# EasyEDA Pro project RK3566_handy_V1.0.epro, schematic RK3566_2, sheets 1 to 8 of 25

## Sheets
1 RK3566_POWER: Board Name: RK3566主板_V2; Create Date: 2026-09-04; Page Name: RK3566_POWER; Project Name: RK3566掌上机; Schematic Name: RK3566_1; Update Date: 2026-09-04; Company: 嘉立创EDA; Page Size: A4; Version: V1.0
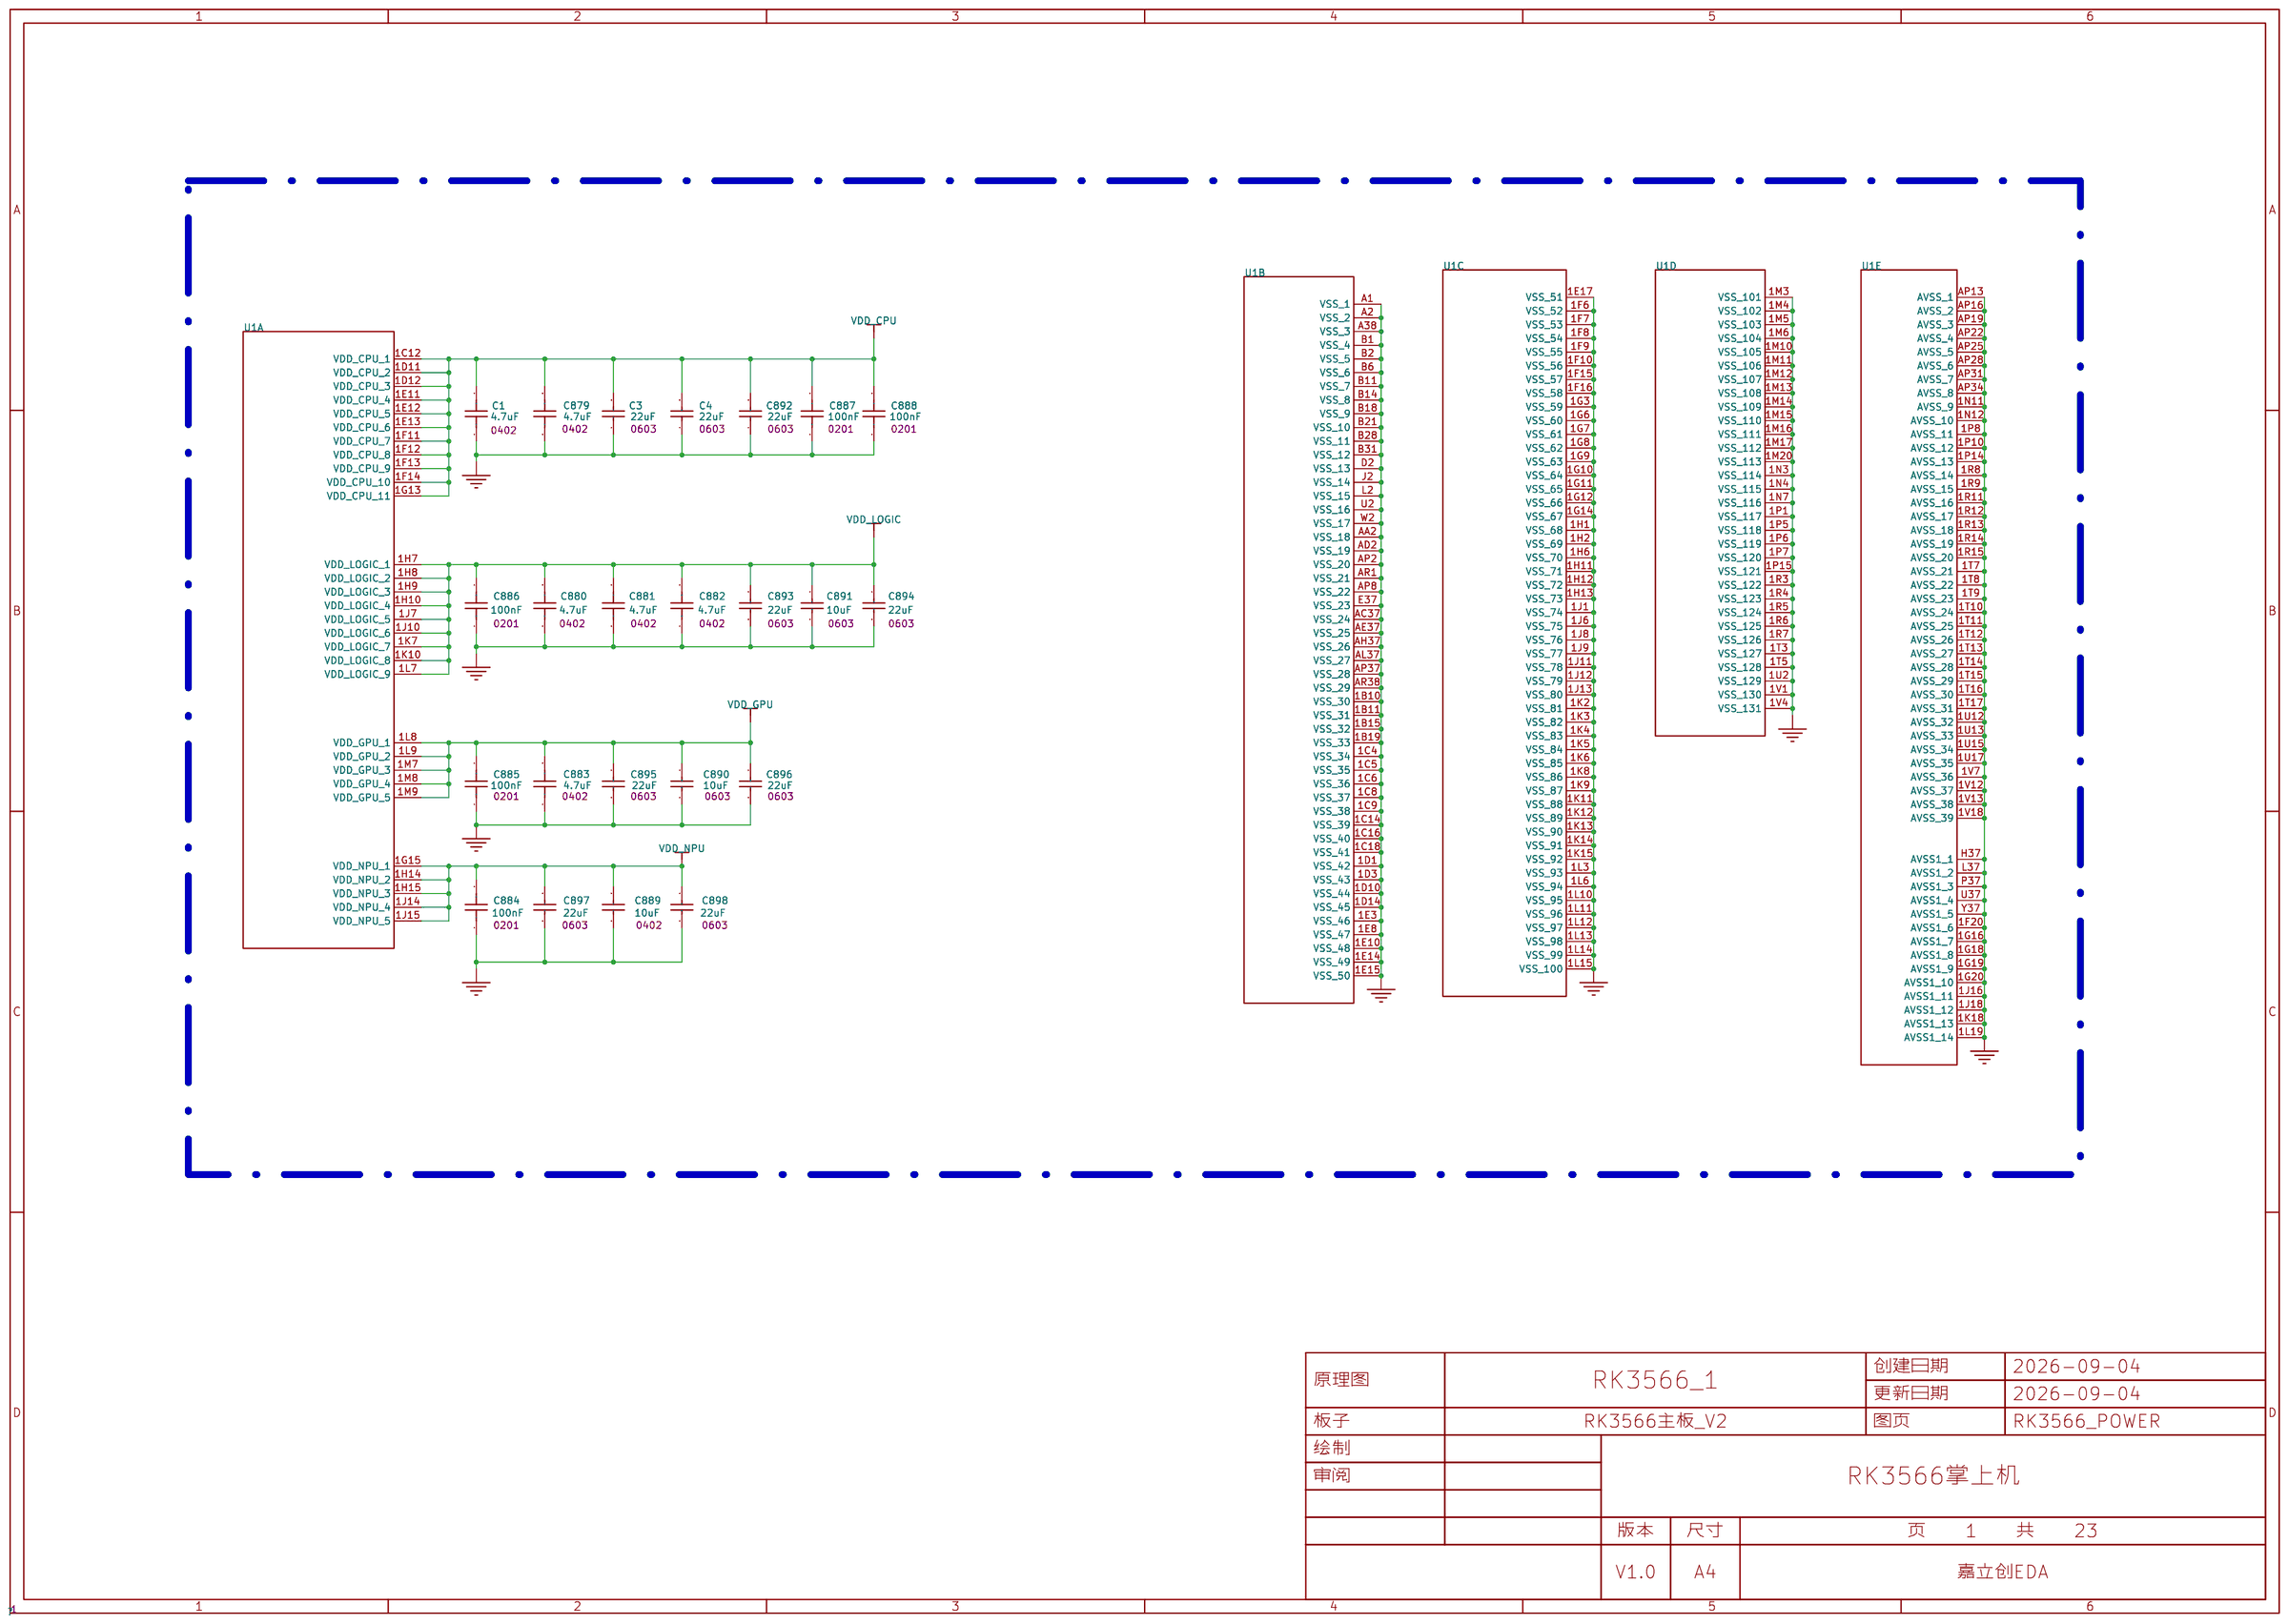
[diagram p0: RK3566_POWER]
2 RK3566_DDR PHY: Page Name: RK3566_DDR PHY
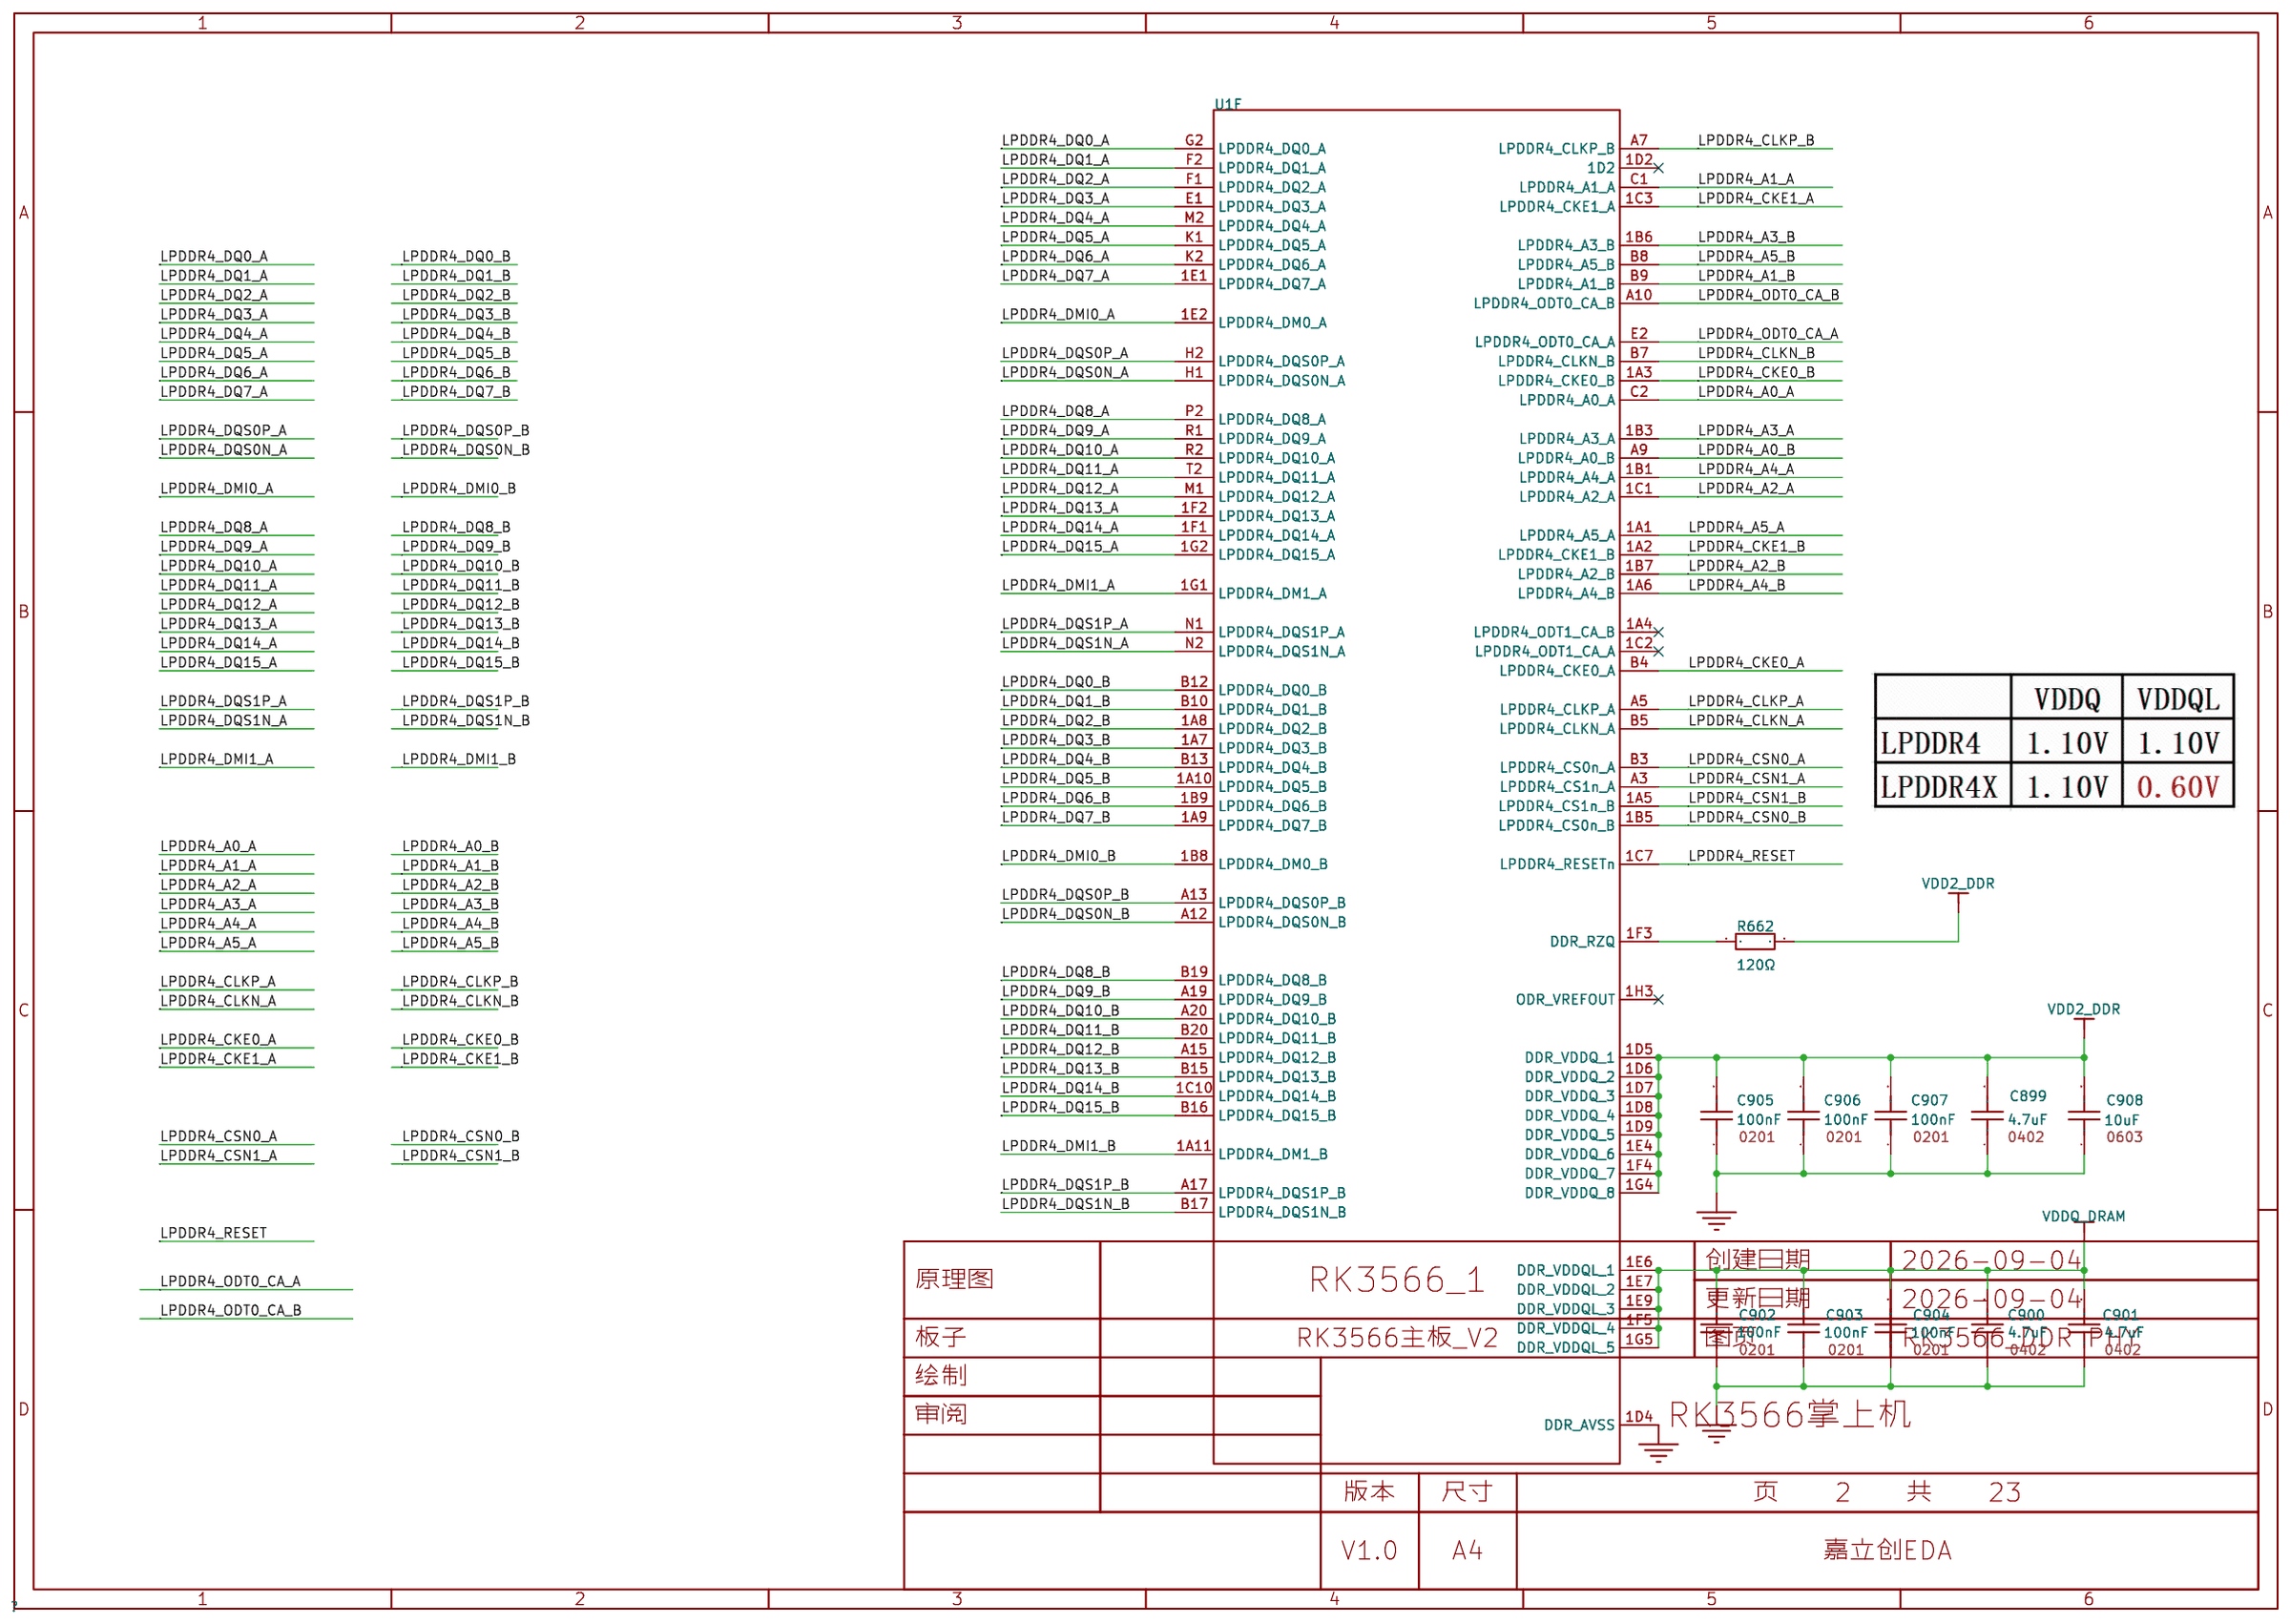
[diagram p1: RK3566_DDR PHY]
3 RK3566_EMMC/SD: Page Name: RK3566_EMMC/SD
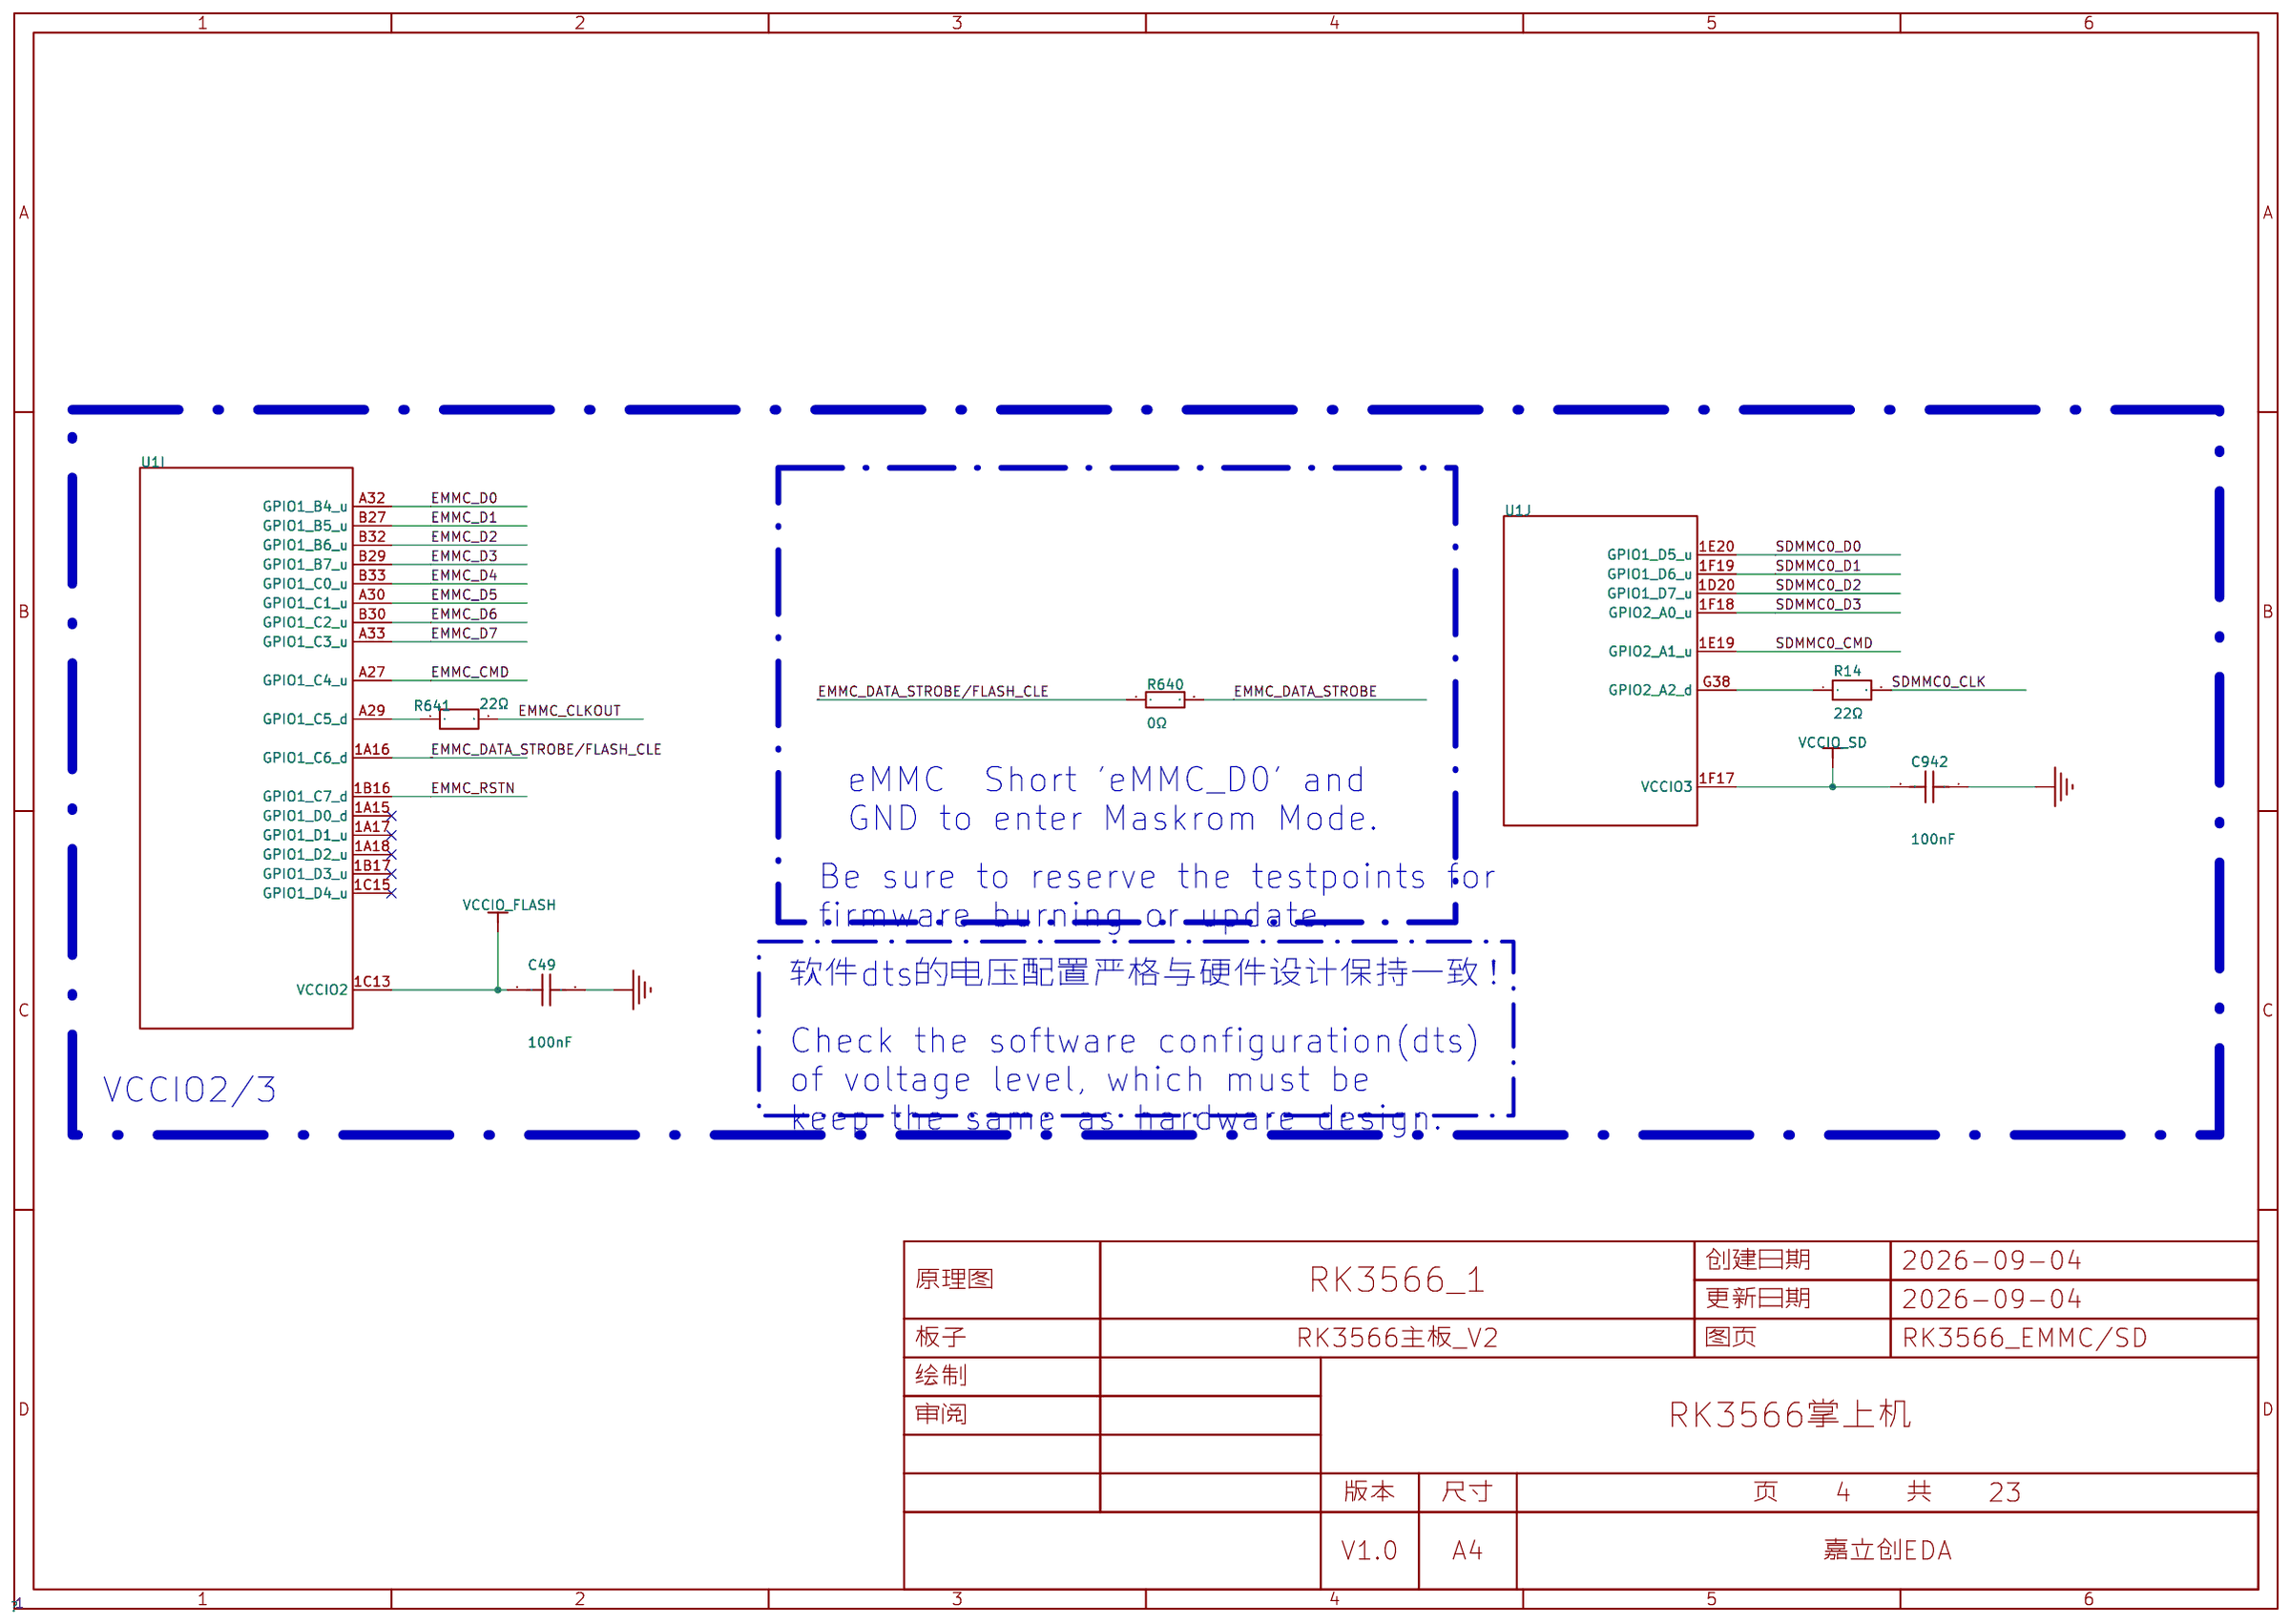
[diagram p2: RK3566_EMMC/SD]
4 RK3566_VO INTERFACE_1: Page Name: RK3566_VO INTERFACE_1
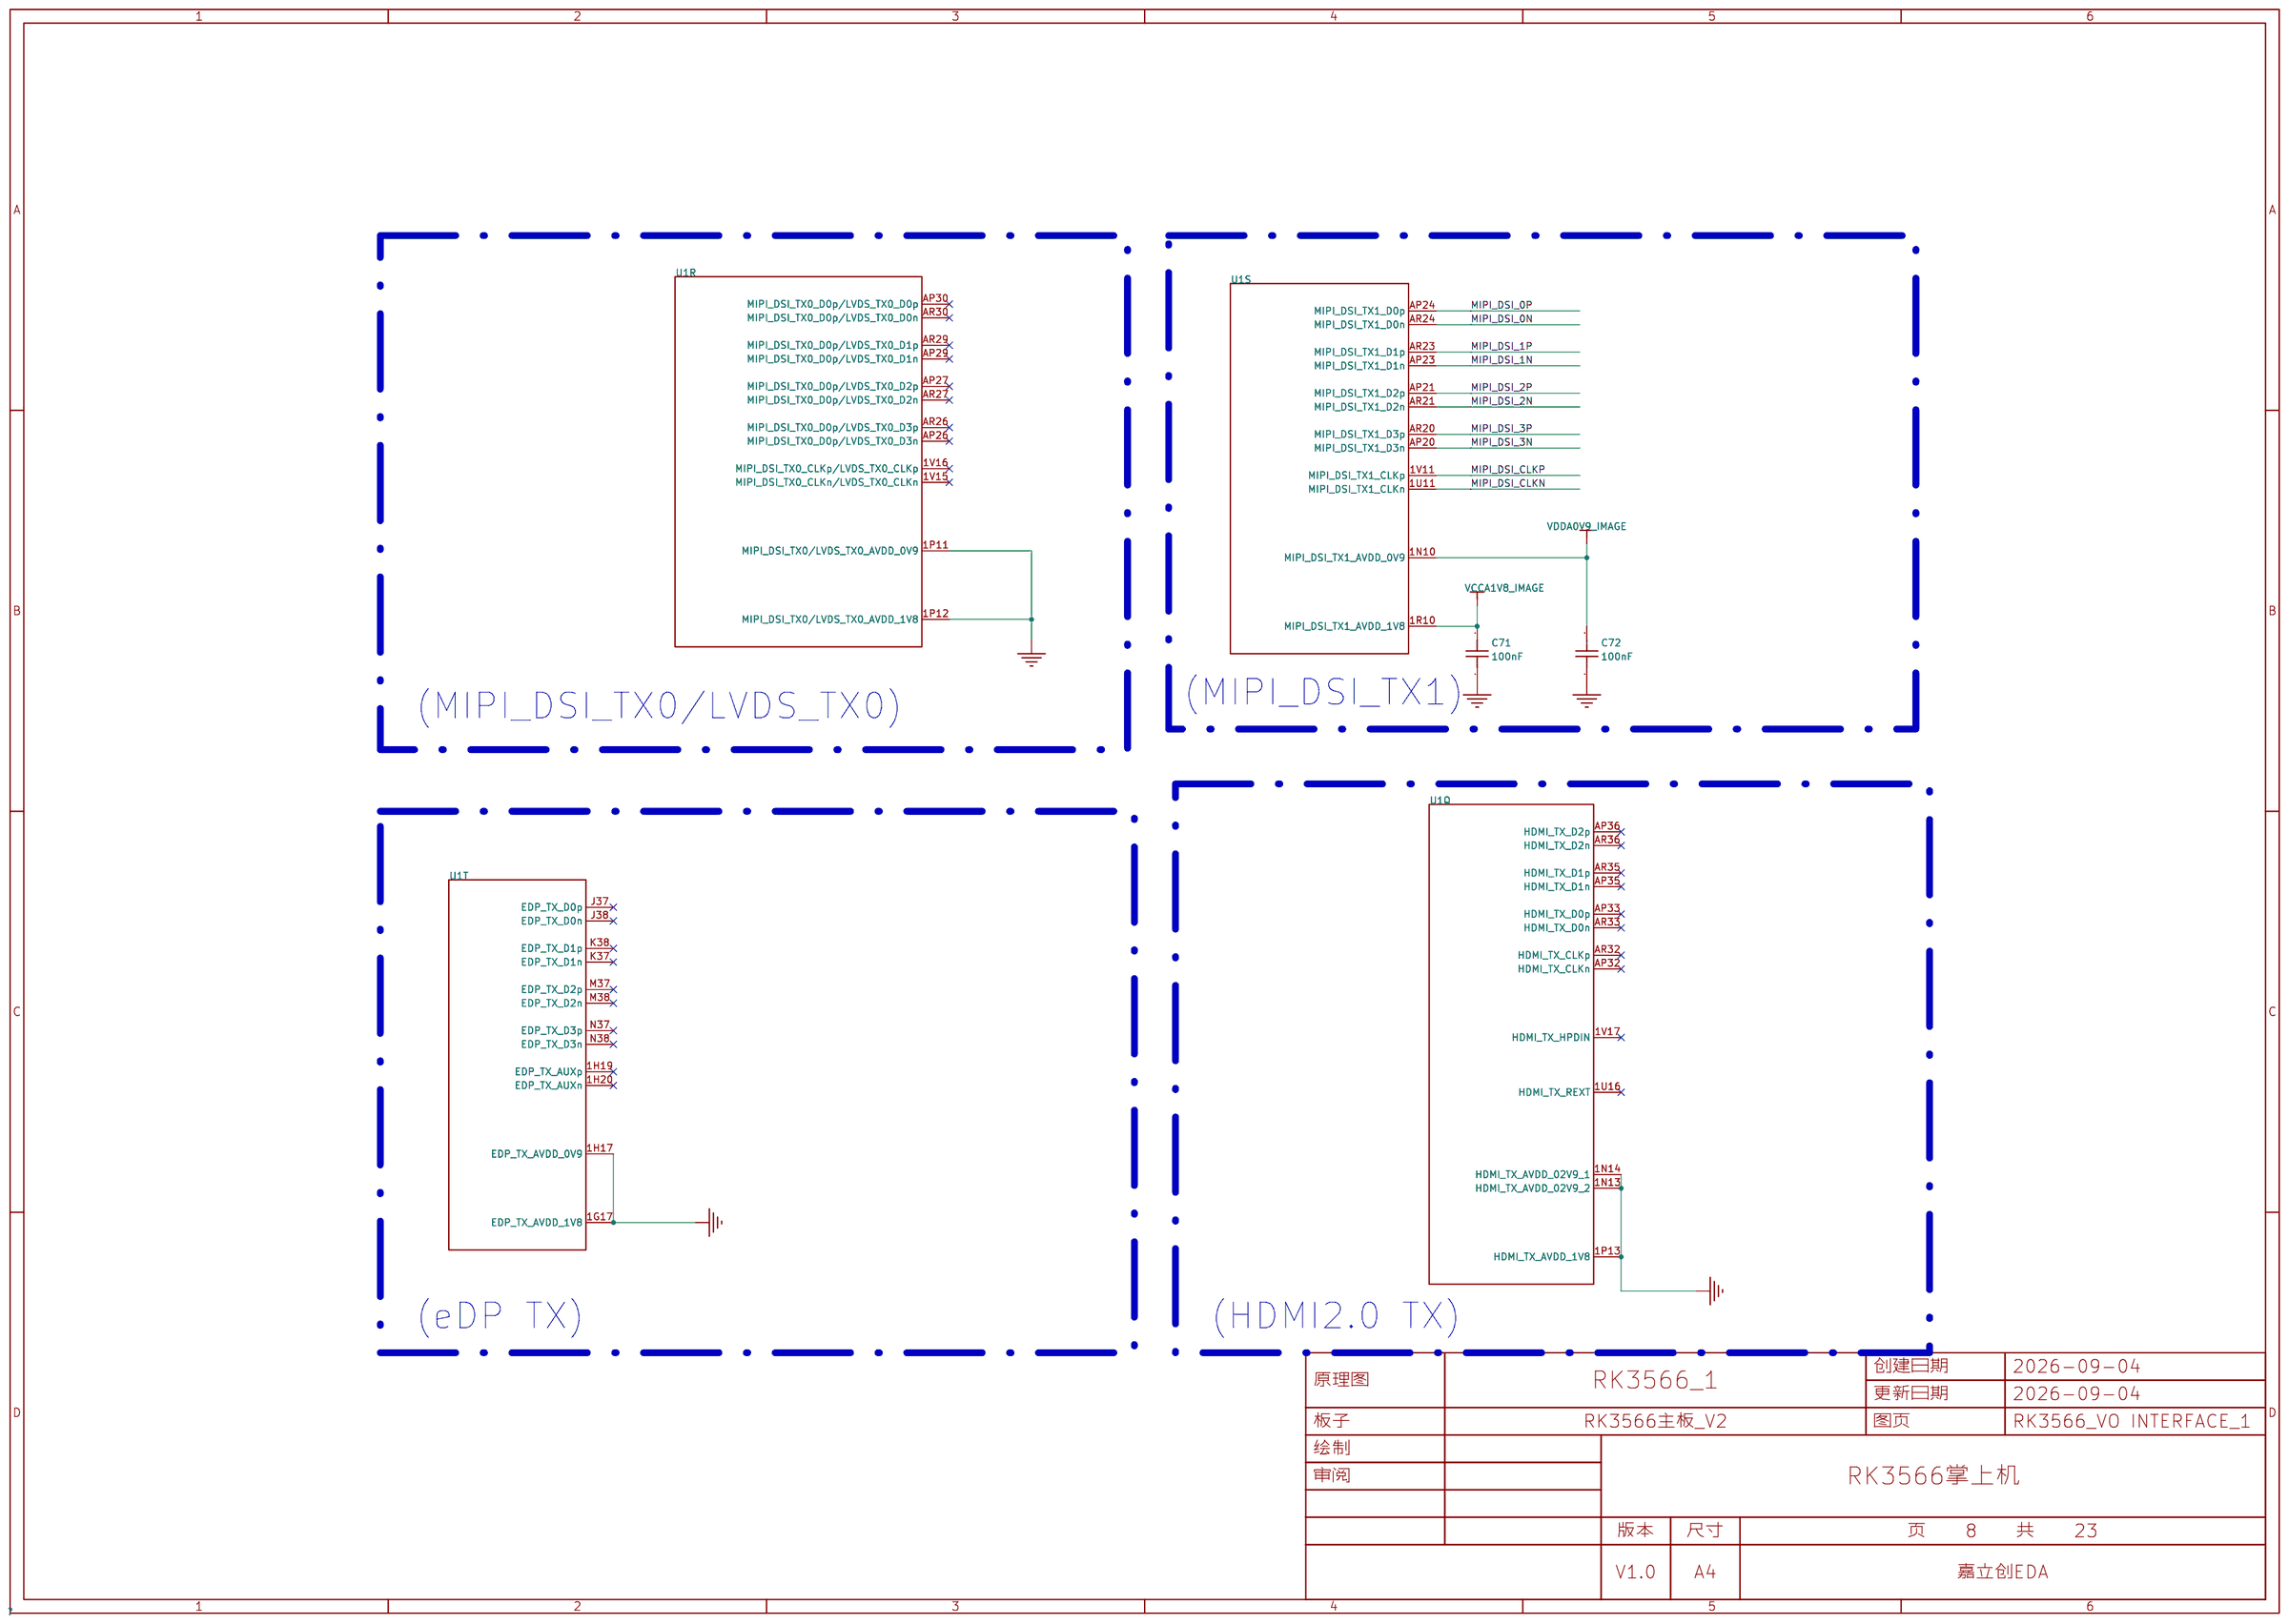
[diagram p3: RK3566_VO INTERFACE_1]
5 RK3566_AUDIO INTERFACE: Board Name: RK3566主板; Page Name: RK3566_AUDIO INTERFACE; Schematic Name: RK3566
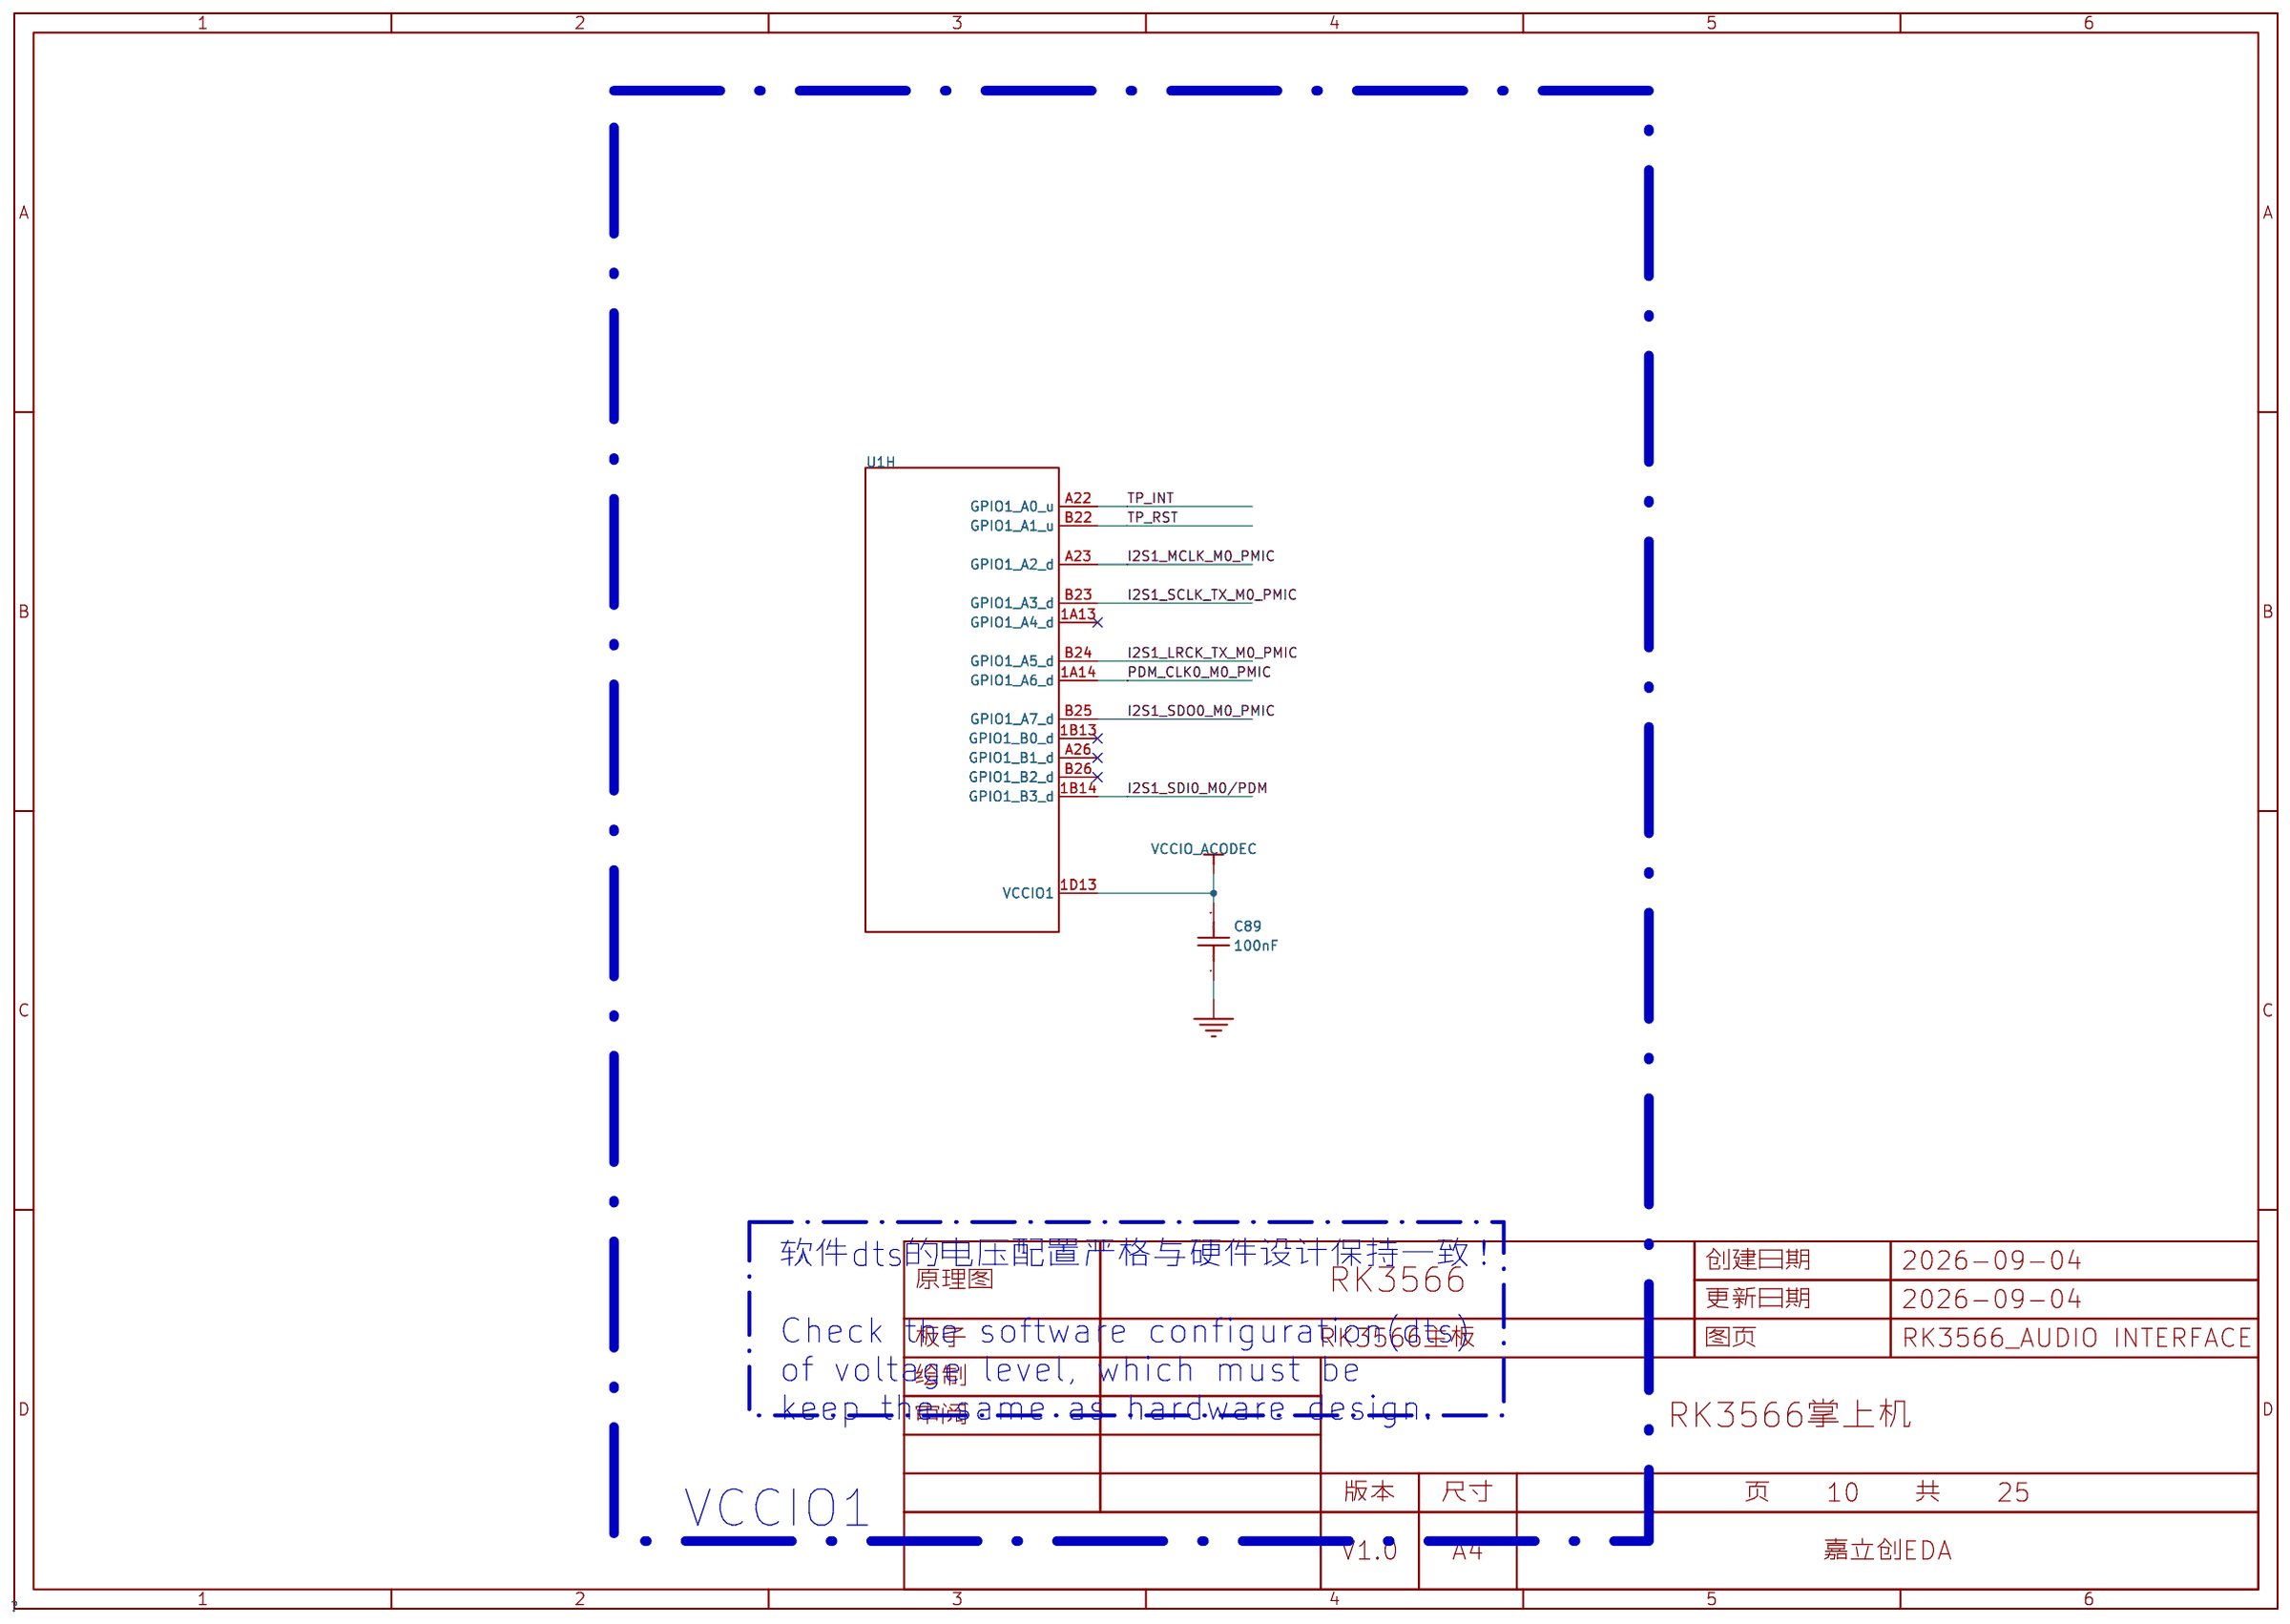
[diagram p4: RK3566_AUDIO INTERFACE]
6 USB OTG: Create Date: 2026-09-19; Page Name: USB OTG; Update Date: 2026-09-19
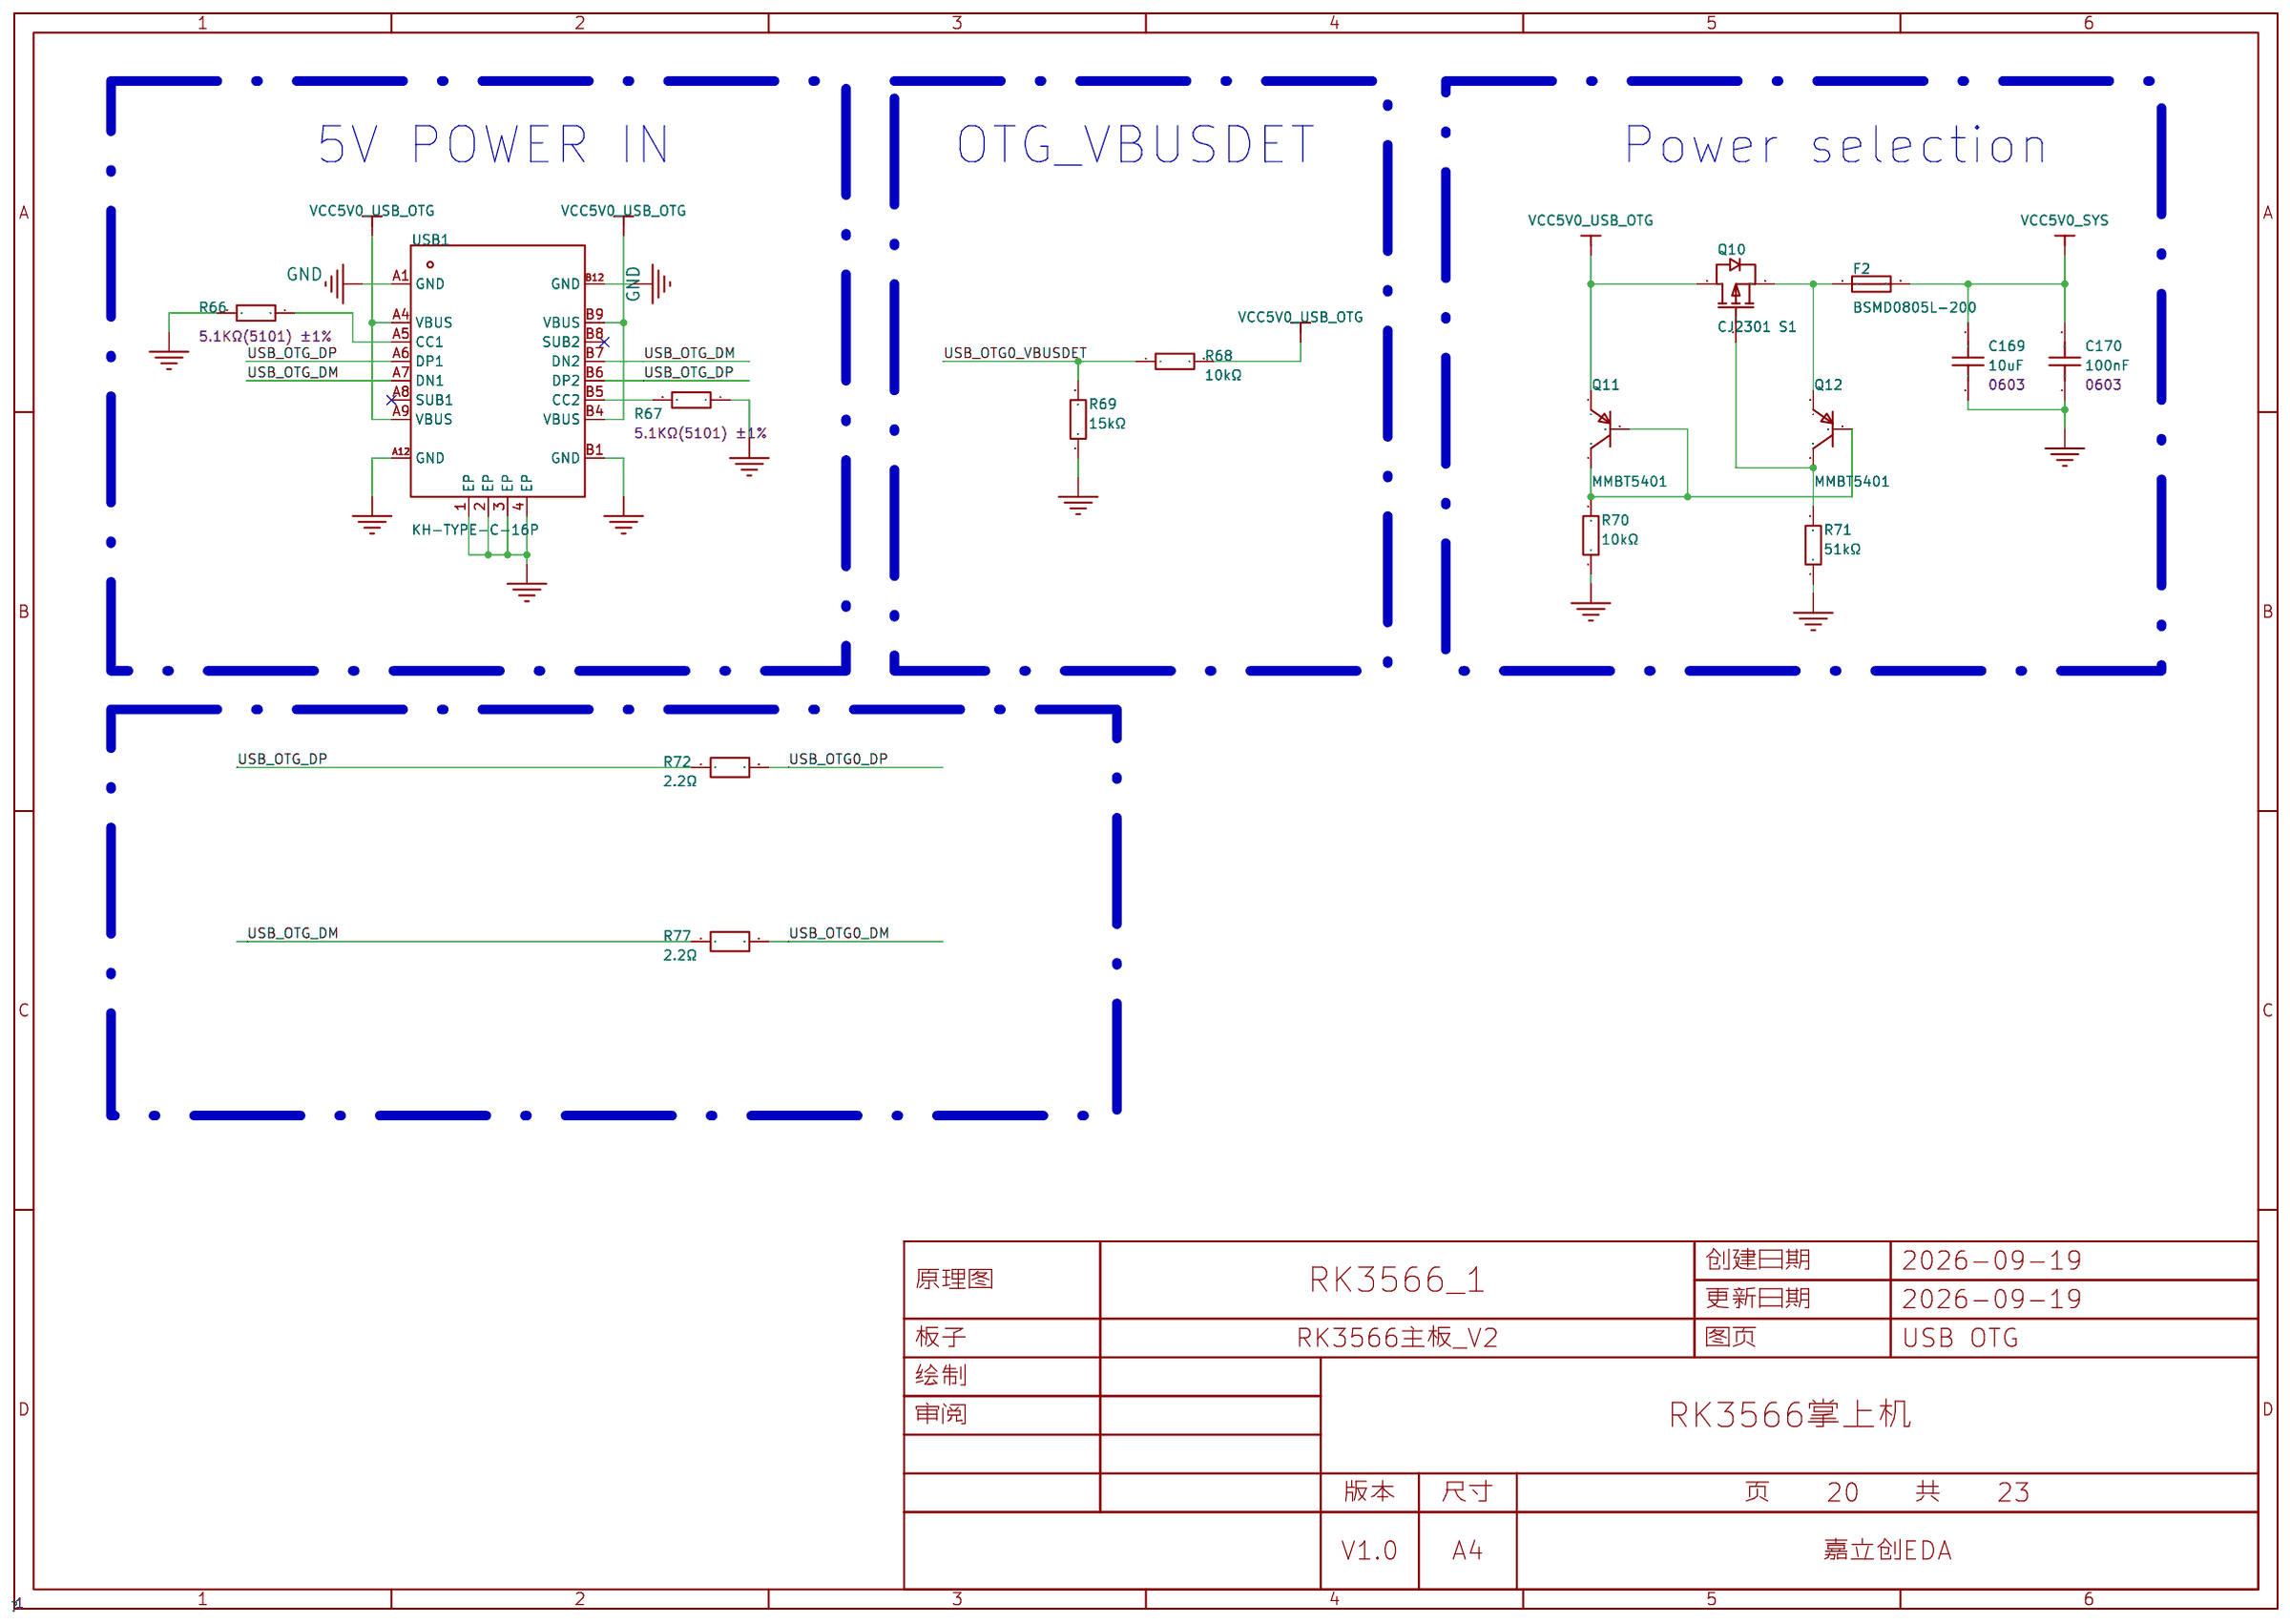
[diagram p5: USB OTG]
7 MIPI_DSI: Create Date: 2026-09-19; Page Name: MIPI_DSI; Update Date: 2026-09-19
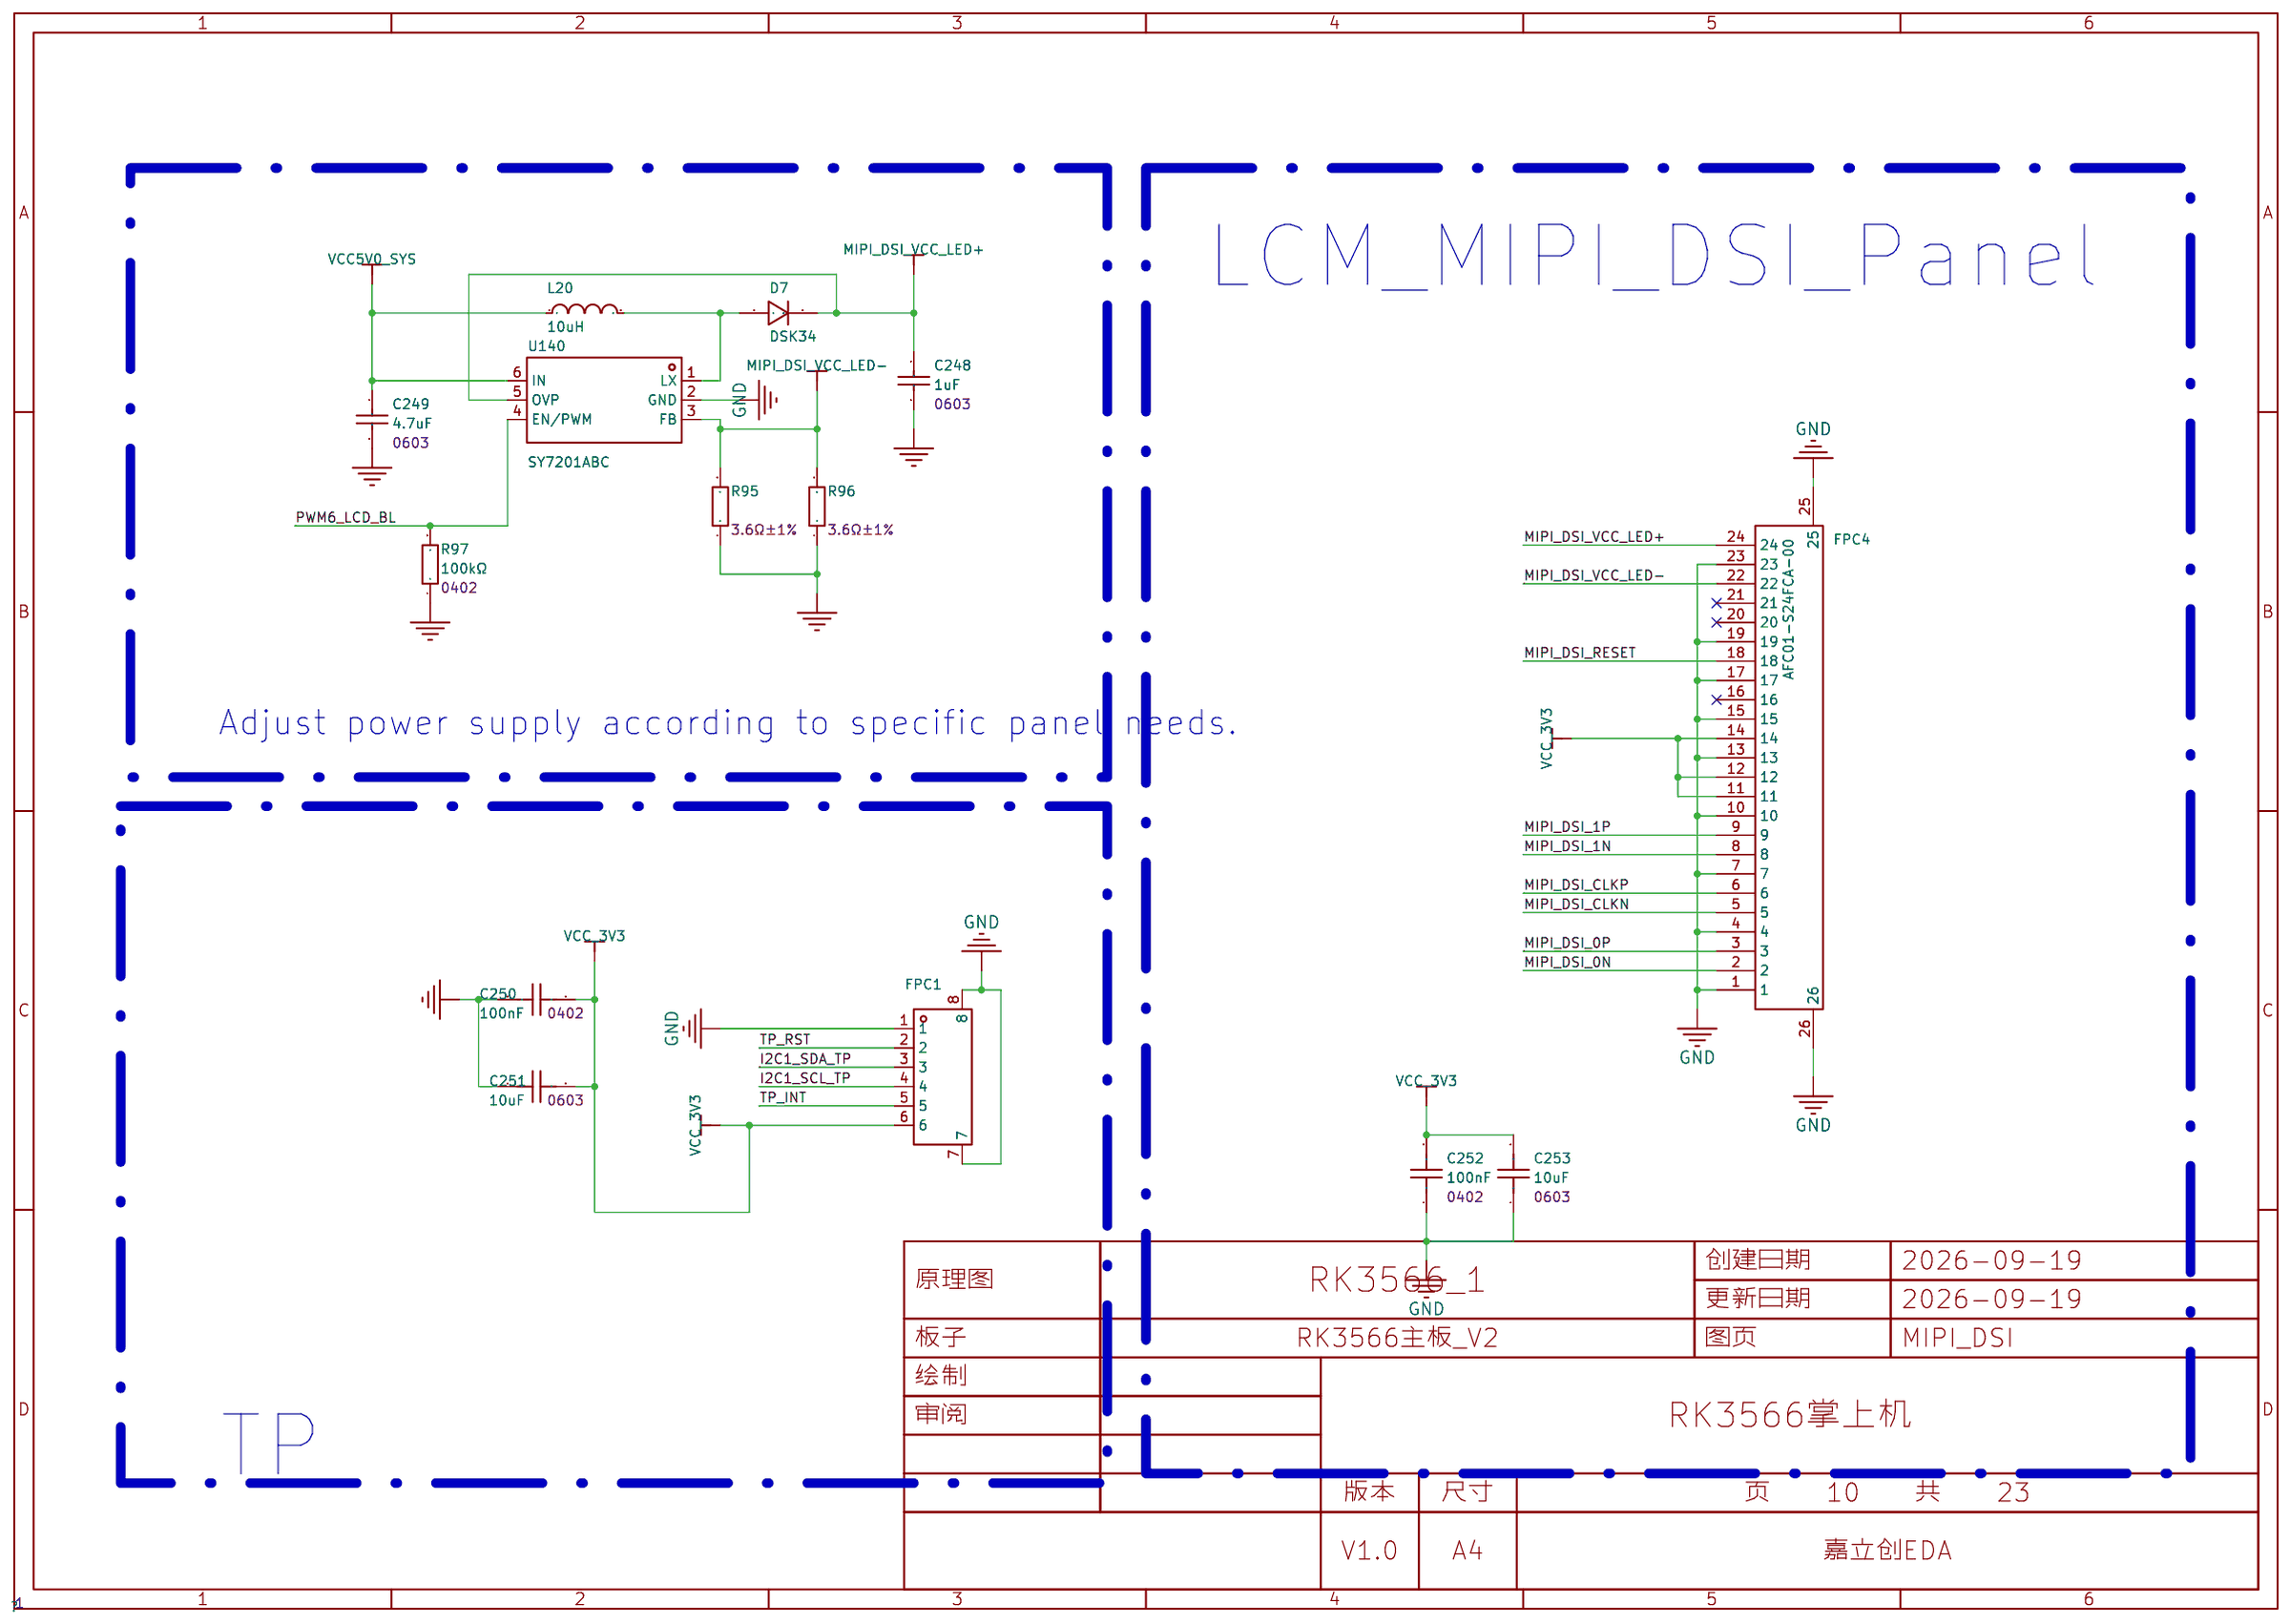
[diagram p6: MIPI_DSI]
8 RK3566_USB/PCIE PHY: Create Date: 2026-09-19; Page Name: RK3566_USB/PCIE PHY; Update Date: 2026-09-19
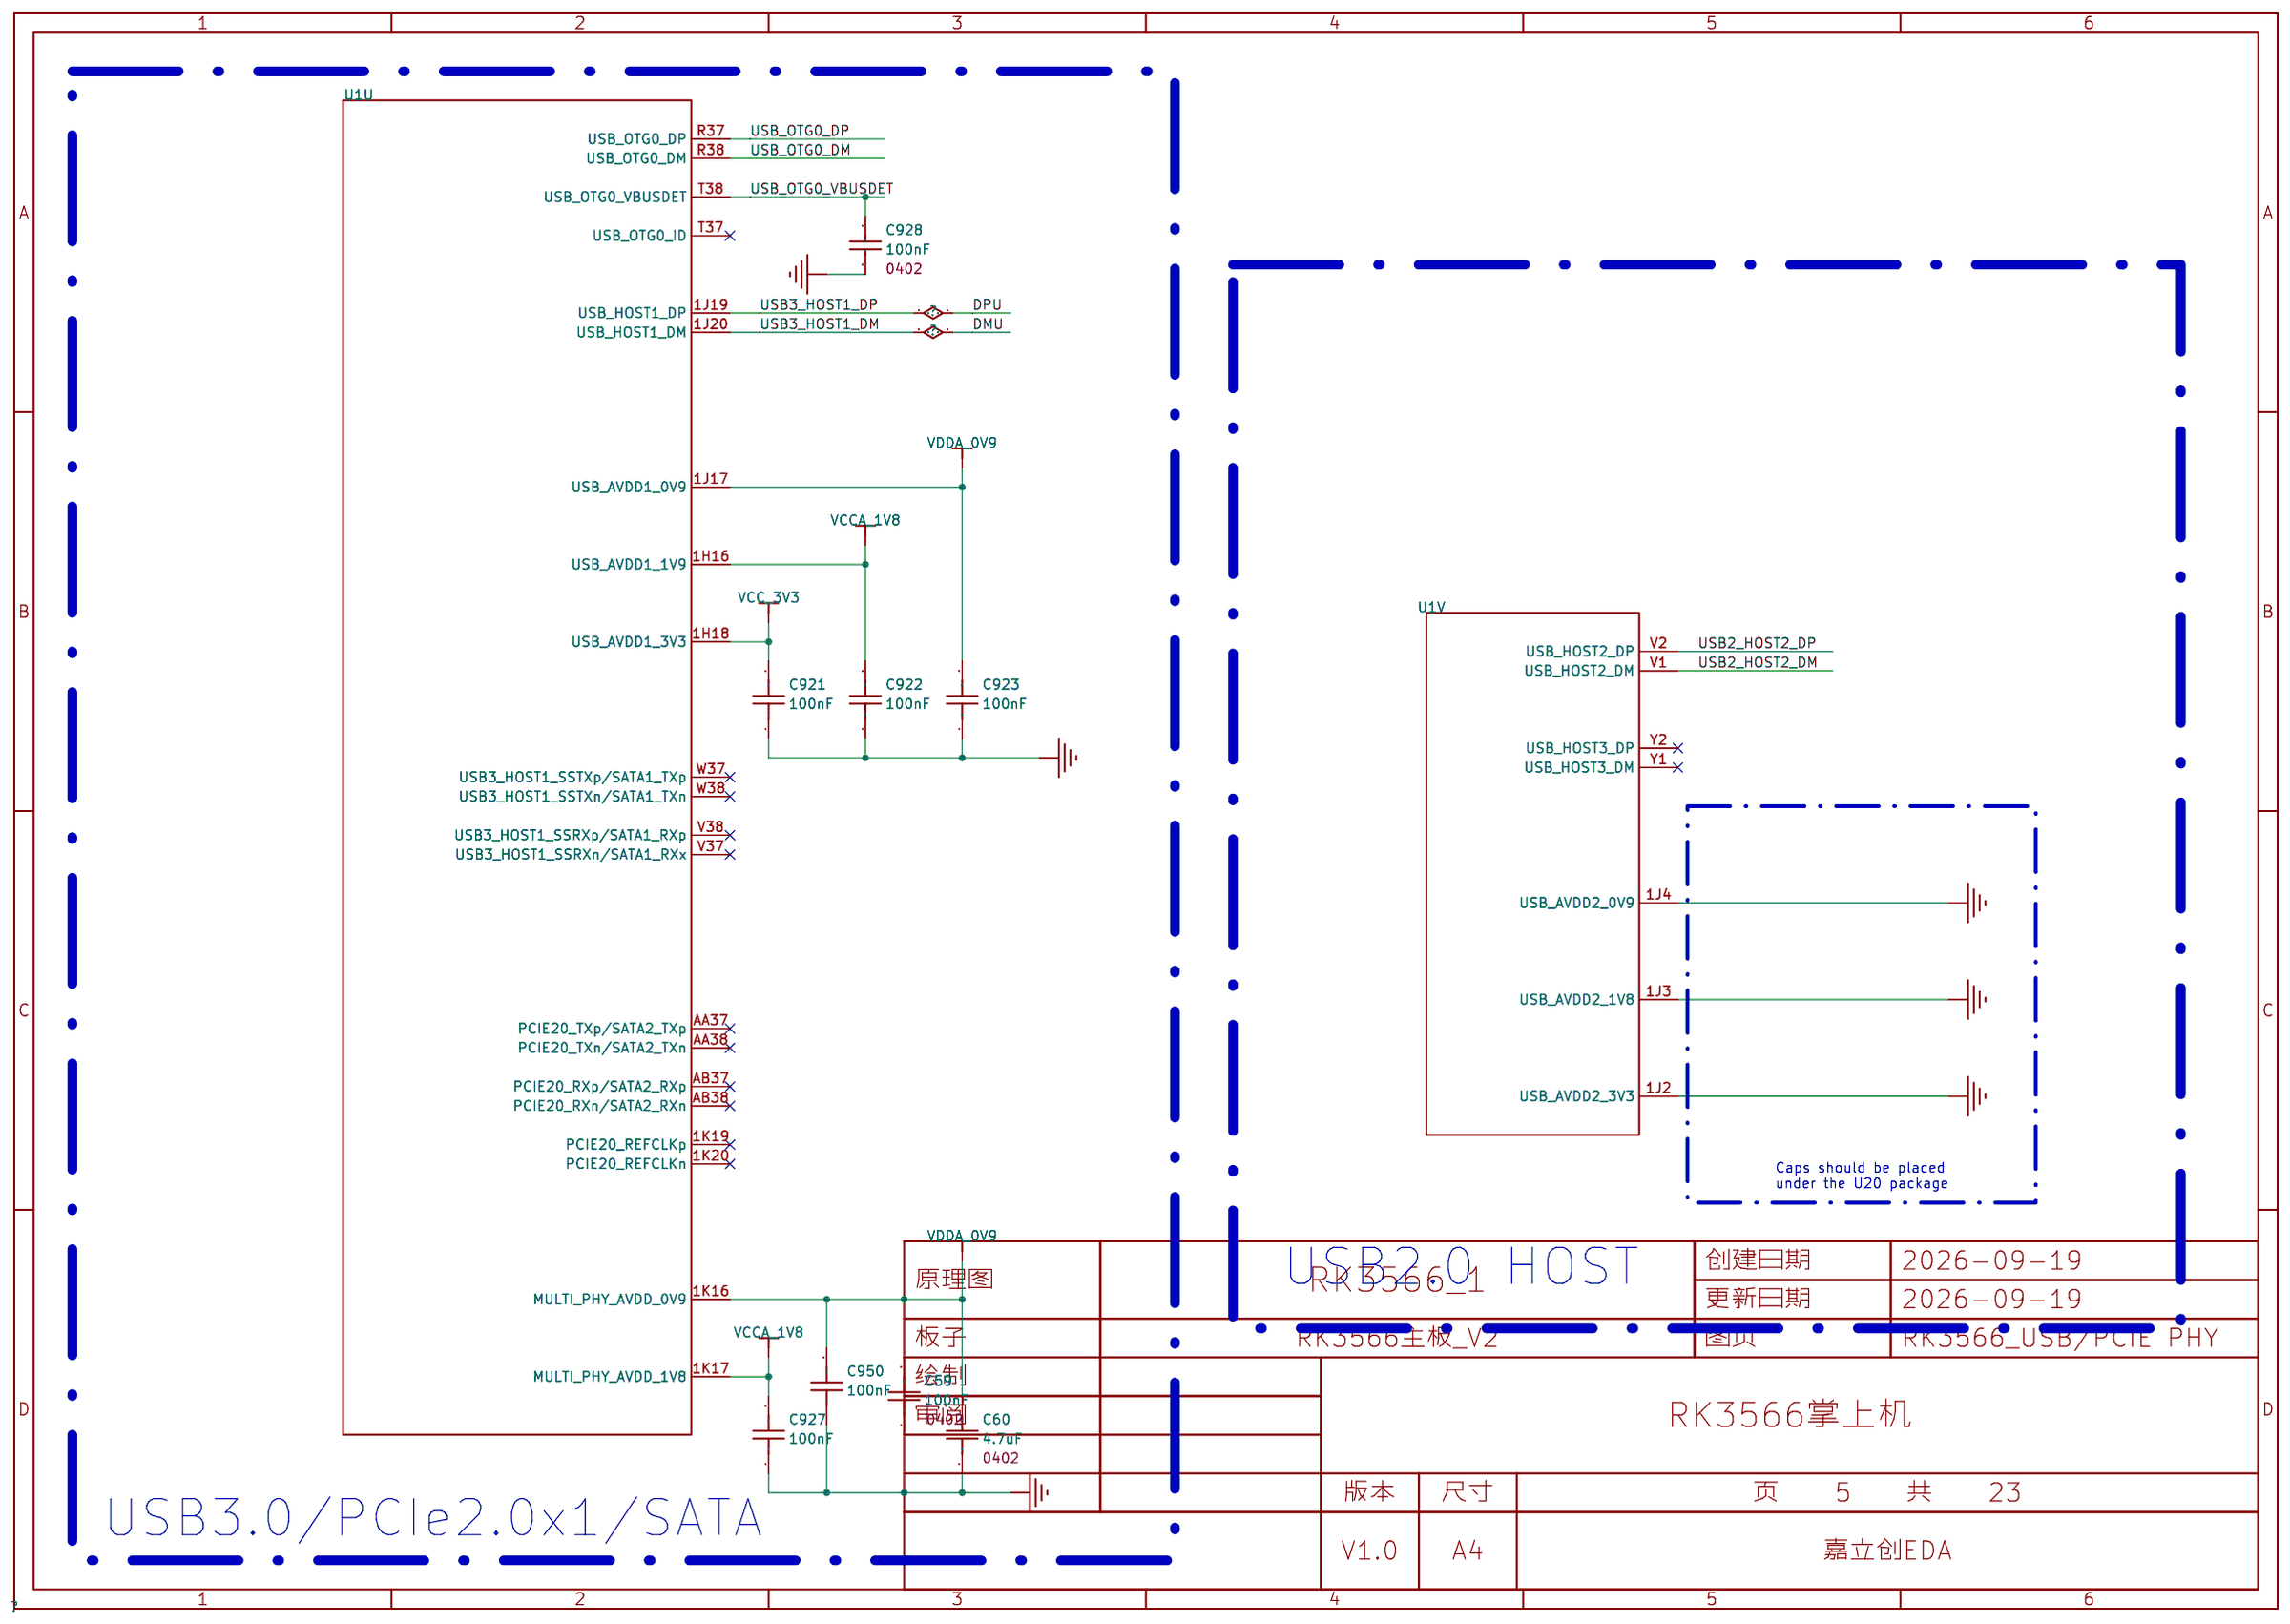
[diagram p7: RK3566_USB/PCIE PHY]

## Parts
sheet MIPI_DSI
C248  1uF  [LL_0603]
C249  4.7uF  [LL_0603]
C250  100nF  [LL_0402]
C251  10uF  [LL_0603]
C252  100nF  [LL_0402]
C253  10uF  [LL_0603]
D7  DSK34  [SOD-123FL_L2.7-W1.8-LS3.8-RD]
FPC1  FPC-05F-6PH20  [FPC-SMD_6P-P0.50_XUNPU_FPC-05F-6PH20]
FPC4  AFC01-S24FCA-00  [FPC-SMD_P0.50-24P_FGS-XJ-H2.0]
L20  10uH  [IND-SMD_L2.5-W2.0_WPN252012H]
R95  3.6Ω  [LL_0603]
R96  3.6Ω  [LL_0603]
R97  100kΩ  [LL_0402]
U140  SY7201ABC  [SOT-23-6_L2.9-W1.6-P0.95-LS2.8-BR]
sheet RK3566_AUDIO INTERFACE
C89  100nF  [CC_0201]
sheet RK3566_DDR PHY
C899  4.7uF  [CC0402]
C900  4.7uF  [CC0402]
C901  4.7uF  [CC0402]
C902  100nF  [CC_0201]
C903  100nF  [CC_0201]
C904  100nF  [CC_0201]
C905  100nF  [CC_0201]
C906  100nF  [CC_0201]
C907  100nF  [CC_0201]
C908  10uF  [CC_0603]
R662  120Ω  [RR_0201]
sheet RK3566_EMMC/SD
C49  100nF  [CC_0201]
C942  100nF  [CC_0201]
R14  22Ω  [RR_0402]
R640  0Ω  [LL_0402]
R641  22Ω  [LL_0402]
sheet RK3566_POWER
C1  4.7uF  [CC0402]
C3  22uF  [CC_0603]
C4  22uF  [CC_0603]
C879  4.7uF  [CC0402]
C880  4.7uF  [CC0402]
C881  4.7uF  [CC0402]
C882  4.7uF  [CC0402]
C883  4.7uF  [CC0402]
C884  100nF  [CC_0201]
C885  100nF  [CC_0201]
C886  100nF  [CC_0201]
C887  100nF  [CC_0201]
C888  100nF  [CC_0201]
C889  10uF  [CC0402]
C890  10uF  [CC_0603]
C891  10uF  [CC_0603]
C892  22uF  [CC_0603]
C893  22uF  [CC_0603]
C894  22uF  [CC_0603]
C895  22uF  [CC_0603]
C896  22uF  [CC_0603]
C897  22uF  [CC_0603]
C898  22uF  [CC_0603]
U1  -  [BGA-565_L15.5-W14.4-P0.40_RK3566_1]  (sections 1,10,11,12,13,14,15,16,17,18,19,2,20,21,22,3,4,5,6,7,8,9)
sheet RK3566_USB/PCIE PHY
C59  100nF  [CC0402]
C60  4.7uF  [CC0402]
C921  100nF  [CC_0201]
C922  100nF  [CC_0201]
C923  100nF  [CC_0201]
C927  100nF  [CC_0201]
C928  100nF  [CC0402]
C950  100nF  [CC_0201]
sheet RK3566_VO INTERFACE_1
C71  100nF  [CC_0201]
C72  100nF  [CC_0201]
sheet USB OTG
C169  10uF  [LL_0603]
C170  100nF  [LL_0603]
F2  BSMD0805L-200  [F0805]
Q10  CJ2301 S1  [SOT-23-3_L3.0-W1.7-P0.95-LS2.9-BR]
Q11  MMBT5401  [SOT-23-3_L2.9-W1.3-P1.90-LS2.4-BR]
Q12  MMBT5401  [SOT-23-3_L2.9-W1.3-P1.90-LS2.4-BR]
R66  5.1kΩ  [LL_0402]
R67  5.1kΩ  [LL_0402]
R68  10kΩ  [LL_0402]
R69  15kΩ  [LL_0402]
R70  10kΩ  [LL_0402]
R71  51kΩ  [LL_0402]
R72  2.2Ω  [LL_0402]
R77  2.2Ω  [LL_0402]
USB1  KH-TYPE-C-16P  [USB-C-SMD_KH-TYPE-C-16P]

## Library data of the parts
C248 = CL10A105KO8NNNC: 容值:1uF;精度:±10%;额定电压:16V;材质(温度系数):X5R;; LCSC Part Name: 1uF ±10% 16V; Supplier Part: C1592; Manufacturer: SAMSUNG(三星); Supplier Footprint: 0603; JLCPCB Part Class: Extended Part; Datasheet: https://atta.szlcsc.com/upload/public/pdf/source/20220919/9FBE606BE0D9532D730F292EB26DC5BB.pdf; Supplier: LCSC; Tolerance: ±10%; Voltage Rated: 16V; Temperature Coefficient: X5R
C249 = CL10A475KO8NNNC: 容值:4.7uF;精度:±10%;额定电压:16V;温度系数:X5R;; LCSC Part Name: 4.7uF ±10% 16V; Supplier Part: C19666; Manufacturer: SAMSUNG(三星); Supplier Footprint: 0603; JLCPCB Part Class: 基础库; Datasheet: https://item.szlcsc.com/datasheet/CL10A475KO8NNNC/20375.html; Supplier: LCSC; Tolerance: ±10%; Voltage Rating: 16V; Temperature Coefficient: X5R; Voltage Rated: 16V
C250 C252 = CL05B104KB54PNC: 容值:100nF;精度:±10%;额定电压:50V;温度系数:X7R;; LCSC Part Name: 100nF ±10% 50V; Supplier Part: C307331; Manufacturer: SAMSUNG(三星); Supplier Footprint: 0402; JLCPCB Part Class: 基础库; Datasheet: https://item.szlcsc.com/datasheet/CL05B104KB54PNC/291005.html; Supplier: LCSC; Tolerance: ±10%; Voltage Rating: 50V; Temperature Coefficient: X7R; Voltage Rated: 50V
C169 C251 C253 C890 C891 C908 = CL10A106KP8NNNC: 容值:10uF;精度:±10%;额定电压:10V;材质(温度系数):X5R;; LCSC Part Name: 10uF ±10% 10V; Supplier Part: C19702; Manufacturer: SAMSUNG(三星); Supplier Footprint: 0603; JLCPCB Part Class: Basic Part; Datasheet: https://atta.szlcsc.com/upload/public/pdf/source/20160103/1457707703378.pdf; Supplier: LCSC; Tolerance: ±10%; Voltage Rated: 10V; Temperature Coefficient: X5R
D7 = DSK34_C727076: 二极管配置:-;直流反向耐压(Vr):1kV;平均整流电流(Io):1A;正向压降(Vf):1.1V@1A;反向电流(Ir):10uA@1kV;; LCSC Part Name: 电压:40V 电流:3A; Supplier Part: C727076; Manufacturer: TWGMC(迪嘉); Supplier Footprint: SOD-123FL; JLCPCB Part Class: 扩展库; Datasheet: https://item.szlcsc.com/datasheet/DSK34/774181.html; Supplier: LCSC; Voltage - Forward(Vf@If): 520mV@3A; Voltage - DC Reverse(Vr): 40V; Current - Rectified: 3A; Reverse Leakage Current (Ir): 500uA; Operating Junction Temperature Range: -55℃~+125℃; Non-Repetitive Peak Forward Surge Current: 80A; Reverse Voltage (Vr): 1kV; Average Rectified Current (Io): 1A; Forward Voltage (Vf@If): 1.1V@1A; Reverse Leakage Current: 10uA@1kV
FPC1 = FPC-05F-6PH20: 间距:0.5mm;触点数量:6P;锁定特性:翻盖式;触点类型:下接;安装类型:卧贴;工作温度范围:-25℃~+85℃;; LCSC Part Name: 间距:0.5mm P数:6P 翻盖式 下接; Supplier Part: C2856796; Manufacturer: XUNPU(讯普); Supplier Footprint: SMD,P=0.5mm,卧贴; JLCPCB Part Class: 扩展库; Datasheet: https://atta.szlcsc.com/upload/public/pdf/source/20210922/16B003FB53336DDF6538142CC465AC4D.pdf; Supplier: LCSC; Pitch: 0.5mm; Number of Contacts: 6P; Locking Feature: 翻盖式; FFC, FCB Thickness: 0.3mm; Contact Type: 下接; Mounting Type: 卧贴; Height Above Board: 2mm; Operating Temperature Range: -25℃~+85℃
FPC4 = AFC01-S24FCA-00: 间距:0.5mm;触点数量:24P;锁定特性:翻盖式;触点类型:下接;安装类型:卧贴;; LCSC Part Name: 间距:0.5mm P数:24P 翻盖式 下接; Supplier Part: C262669; Manufacturer: JS(钜硕电子); Supplier Footprint: SMD,P=0.5mm,卧贴; JLCPCB Part Class: 扩展库; Datasheet: https://atta.szlcsc.com/upload/public/pdf/source/20190816/C413942_2A72D1AC756EAE17EEDF756A339D4500.pdf; Supplier: LCSC; Locking Feature: 翻盖式; Contact Type: 下接; Number of Contacts: 24P; Pitch: 0.5mm; Mounting Type: 卧贴; FFC, FCB Thickness: 0.3mm; Height Above Board: 2mm
L20 = WPN252012H100MT: 电感值:10uH;精度:±20%;额定电流:850mA;饱和电流(Isat):1.1A;类型:-;; LCSC Part Name: 10uH ±20% 1.1A; Supplier Part: C98353; Manufacturer: Sunlord(顺络); Supplier Footprint: 1008; JLCPCB Part Class: Extended Part; Datasheet: https://item.szlcsc.com/datasheet/WPN252012H100MT/99562.html; Supplier: LCSC; Tolerance: ±20%; Current Rating: 850mA; Current - Saturation(Isat): 1.1A; DC Resistance(DCR): 480mΩ; Rated Current: 850mA; DC Resistance (DCR): 480mΩ; Saturation Current (Isat): 110mA; Frequency - Self Resonant: 2MHz
R95 R96 = 0603WAF360KT5E: 电阻类型:厚膜电阻;阻值:3.6Ω;精度:±1%;功率:100mW;工作电压:75V;温度系数:±200ppm/℃;; LCSC Part Name: 3.6Ω±1%; Supplier Part: C23015; Manufacturer: UNI-ROYAL(厚声); Supplier Footprint: 0603; JLCPCB Part Class: 扩展库; Datasheet: https://item.szlcsc.com/datasheet/0603WAF360KT5E/23742.html; Supplier: LCSC; Type: 厚膜电阻; Tolerance: ±1%; Power(Watts): 100mW; Voltage-Supply(Max): 75V; Temperature Coefficient: ±200ppm/℃; Operating Temperature: -55℃~+155℃
R97 = 0402WGF1003TCE: 电阻类型:厚膜电阻;阻值:100kΩ;精度:±1%;功率:62.5mW;工作电压:50V;温度系数:±100ppm/℃;; LCSC Part Name: 100kΩ ±1% 62.5mW 厚膜电阻; Supplier Part: C25741; Manufacturer: UNI-ROYAL(厚声); Supplier Footprint: 0402; JLCPCB Part Class: 基础库; Datasheet: https://item.szlcsc.com/datasheet/0402WGF1003TCE/26484.html; Supplier: LCSC; Type: 厚膜电阻; Tolerance: ±1%; Power(Watts): 62.5mW; Voltage-Supply(Max): 50V; Temperature Coefficient: ±100ppm/℃; Operating Temperature: -55℃~+155℃; Overload Voltage (Max): 50V; Operating Temperature Range: -55℃~+155℃
U140 = SY7201ABC: 拓扑结构:升压;; Supplier Part: C82173; Manufacturer: Silergy(矽力杰); Supplier Footprint: SOT-23-6; JLCPCB Part Class: 扩展库; Datasheet: https://item.szlcsc.com/datasheet/SY7201ABC/83328.html; Supplier: LCSC; Topology: 升压
C71 C72 C89 C884-C888 C902-C907 C921-C923 C927 C942 C950 = CL03A104KO3NNNC: 容值:100nF;精度:±10%;额定电压:16V;材质(温度系数):X5R;; LCSC Part Name: 100nF ±10% 16V; Supplier Part: C307380; Manufacturer: SAMSUNG(三星); Supplier Footprint: 0201; JLCPCB Part Class: Extended Part; Datasheet: https://atta.szlcsc.com/upload/public/pdf/source/20181009/C307380_E0679AAF9658ADA26DBF30CED0CA6925.pdf; Supplier: LCSC; Tolerance: ±10%; Voltage Rated: 16V; Temperature Coefficient: X5R
C1 C60 C879-C883 C899-C901 = CL05A475MQ5NRNC: 容值:4.7uF;精度:±20%;额定电压:6.3V;材质(温度系数):X5R;; LCSC Part Name: 4.7uF ±20% 6.3V; Supplier Part: C307423; Manufacturer: SAMSUNG(三星); Supplier Footprint: 0402; JLCPCB Part Class: Extended Part; Datasheet: https://atta.szlcsc.com/upload/public/pdf/source/20181010/C307423_0E0C4E35F3A09F81C2E5C84E00499E42.pdf; Supplier: LCSC; Tolerance: ±20%; Voltage Rated: 6.3V; Temperature Coefficient: X5R
R662 = RC0201FR-07120RL: 电阻类型:厚膜电阻;阻值:120Ω;精度:±1%;功率:50mW;工作电压:25V;温度系数:±200ppm/℃;; LCSC Part Name: 厚膜电阻 120Ω ±1% 50mW; Supplier Part: C295718; Manufacturer: YAGEO(国巨); Supplier Footprint: 0201; JLCPCB Part Class: 扩展库; Datasheet: https://item.szlcsc.com/datasheet/RC0201FR-07120RL/280185.html; Supplier: LCSC; Type: 厚膜电阻; Tolerance: ±1%; Power(Watts): 50mW; Voltage-Supply(Max): 25V; Temperature Coefficient: ±200ppm/℃; Operating Temperature: -55℃~+125℃
C49 = 0201X104K100NT: 容值:100nF;精度:±10%;额定电压:10V;材质(温度系数):X5R;; LCSC Part Name: 100nF ±10% 10V; Supplier Part: C284966; Manufacturer: FH(风华); Supplier Footprint: 0201; JLCPCB Part Class: Extended Part; Datasheet: https://atta.szlcsc.com/upload/public/pdf/source/20180917/C284966_691DE3C5BF759D23F11C92F3D90121F8.pdf; Supplier: LCSC; Tolerance: ±10%; Voltage Rated: 10V; Temperature Coefficient: X5R
R14 R641 = 0402WGF220JTCE: 电阻类型:厚膜电阻;阻值:22Ω;精度:±1%;功率:62.5mW;温度系数:±100ppm/℃;; LCSC Part Name: 厚膜电阻 22Ω ±1% 62.5mW; Supplier Part: C25092; Manufacturer: UNI-ROYAL(厚声); Supplier Footprint: 0402; JLCPCB Part Class: Basic Part; Datasheet: https://atta.szlcsc.com/upload/public/pdf/source/20200306/C422600_1E6D84923E4A46A82E41ADD87F860B5C.pdf; Supplier: LCSC; Type: 厚膜电阻; Tolerance: ±1%; Power(Watts): 62.5mW; Temperature Coefficient: ±100ppm/℃; Overload Voltage (Max): 50V; Operating Temperature Range: -55℃~+155℃
R640 = ERJ2GE0R00X: 电阻类型:-;阻值:0Ω;功率:100mW;温度系数:-100ppm/℃~+600ppm/℃;最大工作电压:-;工作温度范围:-55℃~+155℃;; LCSC Part Name: 0Ω 100mW; Supplier Part: C242160; Manufacturer: PANASONIC(松下); Supplier Footprint: 0402; JLCPCB Part Class: 扩展库; Datasheet: https://atta.szlcsc.com/upload/public/pdf/source/20181106/C242160_CA6E41971DE5A1DCD79442F3CF334CD6.pdf; Supplier: LCSC; Power(Watts): 100mW; Temperature Coefficient: -100ppm/℃~+600ppm/℃; Operating Temperature Range: -55℃~+155℃
C3 C4 C892-C898 = CL10A226MQ8NRNC: 容值:22uF;精度:±20%;额定电压:6.3V;材质(温度系数):X5R;; LCSC Part Name: 22uF ±20% 6.3V; Supplier Part: C59461; Manufacturer: SAMSUNG(三星); Supplier Footprint: 0603; JLCPCB Part Class: Basic Part; Datasheet: https://atta.szlcsc.com/upload/public/pdf/source/20160103/1457707740762.pdf; Supplier: LCSC; Tolerance: ±20%; Voltage Rated: 6.3V; Temperature Coefficient: X5R
C889 = CL05A106MQ5NUNC: 容值:10uF;精度:±20%;额定电压:6.3V;材质(温度系数):X5R;; LCSC Part Name: 10uF ±20% 6.3V; Supplier Part: C15525; Manufacturer: SAMSUNG(三星); Supplier Footprint: 0402; JLCPCB Part Class: 基础库; Datasheet: https://atta.szlcsc.com/upload/public/pdf/source/20220823/2B02EE04F8F211D38A52DCB16EB6BEBA.pdf; Supplier: LCSC; Tolerance: ±20%; Voltage Rated: 6.3V; Temperature Coefficient: X5R
U1 = RK3566
C59 = CL05B104KO5NNNC: 容值:100nF;精度:±10%;额定电压:16V;材质(温度系数):X7R;; LCSC Part Name: 100nF ±10% 16V; Supplier Part: C1525; Manufacturer: SAMSUNG(三星); Supplier Footprint: 0402; JLCPCB Part Class: Basic Part; Datasheet: https://atta.szlcsc.com/upload/public/pdf/source/20160103/1457707674891.pdf; Supplier: LCSC; Tolerance: ±10%; Voltage Rated: 16V; Temperature Coefficient: X7R
C928 = CL05B104KO5NNNC: 容值:100nF;精度:±10%;额定电压:16V;材质(温度系数):X7R;; LCSC Part Name: 100nF ±10% 16V; Supplier Part: C1525; Manufacturer: SAMSUNG(三星); Supplier Footprint: 0402; JLCPCB Part Class: 基础库; Datasheet: https://atta.szlcsc.com/upload/public/pdf/source/20160103/1457707674891.pdf; Supplier: LCSC; Tolerance: ±10%; Voltage Rated: 16V; Temperature Coefficient: X7R
C170 = CC0603KRX7R9BB104: 容值:100nF;精度:±10%;额定电压:50V;材质(温度系数):X7R;; LCSC Part Name: 100nF ±10% 50V; Supplier Part: C14663; Manufacturer: YAGEO(国巨); Supplier Footprint: 0603; JLCPCB Part Class: Basic Part; Datasheet: https://atta.szlcsc.com/upload/public/pdf/source/20170116/1484561234239.pdf; Supplier: LCSC; Tolerance: ±10%; Voltage Rated: 50V; Temperature Coefficient: X7R
F2 = BSMD0805L-200: 最大电压:6V;最大电流:50A;保持电流:2A;跳闸电流:4A;; LCSC Part Name: 6V 2A 0805自恢复 5秒内动作; Supplier Part: C2757931; Manufacturer: BHFUSE(佰宏); Supplier Footprint: 0805; Datasheet: https://atta.szlcsc.com/upload/public/pdf/source/20220302/84A1D93E6CA84F7719C829CBF191FAF8.pdf; Supplier: LCSC; Operating Voltage (Max): 6V; Current Rating (Max): 50A; Hold Current: 2A; Trip Current: 4A; Power Dissipation: 1W; Resistance - Initial (Ri) (Min): 4mΩ; Resistance - Post Trip (R1) (Max): 45mΩ; Maximum Time to Trip: 5s; Operating Temperature: -40℃~+85℃
Q10 = CJ2301 S1: 类型:P沟道;漏源电压(Vdss):20V;连续漏极电流(Id):2.3A;功率(Pd):350mW;导通电阻(RDS(on)@Vgs,Id):112mΩ@4.5V,2.8A;; LCSC Part Name: P沟道 20V 2.3A; Supplier Part: C8547; Manufacturer: CJ(江苏长电/长晶); Supplier Footprint: SOT-23; JLCPCB Part Class: 扩展库; Datasheet: https://atta.szlcsc.com/upload/public/pdf/source/20140815/1457707224119.pdf; Supplier: LCSC; Type: P沟道; Drain Source Voltage (Vdss): 20V; Continuous Drain Current (Id): 2.3A; Power Dissipation (Pd): 350mW; Drain Source On Resistance (RDS(on)@Vgs,Id): 112mΩ@4.5V,2.8A; Gate Threshold Voltage (Vgs(th)@Id): 1V@250uA
Q11 Q12 = MMBT5401_C8326: 晶体管类型:PNP;集射极击穿电压(Vceo):150V;集电极电流(Ic):600mA;功率(Pd):300mW;集电极截止电流(Icbo):100nA;集电极-发射极饱和电压(VCE(sat)@Ic,Ib):500mV@50mA,5mA;直流电流增益(hFE@Ic,Vce):200@10mA,5V;特征频率(fT):100MHz;工作温度:+150℃@(Tj);; LCSC Part Name: PNP 150V 600mA; Supplier Part: C8326; Manufacturer: CJ(江苏长电/长晶); Supplier Footprint: SOT-23; Datasheet: https://atta.szlcsc.com/upload/public/pdf/source/20140809/1457707213644.pdf; Supplier: LCSC; Transistor Type: PNP; Collector-Emitter Breakdown Voltage (Vceo): 150V; Collector Current (Ic): 600mA; Power Dissipation (Pd): 300mW; Collector Cut-Off Current (Icbo): 100nA; Collector-Emitter Saturation Voltage (VCE(sat)@Ic,Ib): 500mV@50mA,5mA; DC Current Gain (hFE@Ic,Vce): 200@10mA,5V; Transition Frequency (fT): 100MHz; Operating Temperature: +150℃@(Tj)
R66 R67 = 0402WGF5101TCE: 电阻类型:厚膜电阻;阻值:5.1kΩ;精度:±1%;功率:62.5mW;工作电压:50V;温度系数:±100ppm/℃;; LCSC Part Name: 5.1KΩ(5101) ±1%; Supplier Part: C25905; Manufacturer: UNI-ROYAL(厚声); Supplier Footprint: 0402; JLCPCB Part Class: 基础库; Datasheet: https://item.szlcsc.com/datasheet/0402WGF5101TCE/26648.html; Supplier: LCSC; Type: 厚膜电阻; Tolerance: ±1%; Power(Watts): 62.5mW; Voltage-Supply(Max): 50V; Temperature Coefficient: ±100ppm/℃; Operating Temperature: -55℃~+155℃
R68 = CRCW040210K0FKED: 电阻类型:厚膜电阻;阻值:10kΩ;精度:±1%;功率:63mW;温度系数:±100ppm/K;最大工作电压:50V;工作温度范围:-55℃~+155℃;; LCSC Part Name: 10kΩ ±1% 63mW; Supplier Part: C71617; Manufacturer: VISHAY(威世); Supplier Footprint: 0402; JLCPCB Part Class: 扩展库; Datasheet: https://atta.szlcsc.com/upload/public/pdf/source/20180224/C71617_15194370300791364062.pdf; Supplier: LCSC; Type: 厚膜电阻; Tolerance: ±1%; Power(Watts): 63mW; Temperature Coefficient: ±100ppm/K; Overload Voltage (Max): 50V; Operating Temperature Range: -55℃~+155℃
R69 = 0402WGF1502TCE: 电阻类型:厚膜电阻;阻值:15kΩ;精度:±1%;功率:62.5mW;; LCSC Part Name: 15kΩ ±1% 62.5mW; Supplier Part: C25756; Manufacturer: UNI-ROYAL(厚声); Supplier Footprint: 0402; JLCPCB Part Class: 基础库; Datasheet: https://atta.szlcsc.com/upload/public/pdf/source/20200306/C422600_1E6D84923E4A46A82E41ADD87F860B5C.pdf; Supplier: LCSC; Type: 厚膜电阻; Tolerance: ±1%; Power(Watts): 62.5mW; Temperature Coefficient: ±100ppm/℃; Overload Voltage (Max): 50V; Operating Temperature Range: -55℃~+155℃
R70 = 0402WGF1002TCE: 电阻类型:厚膜电阻;阻值:10kΩ;精度:±1%;功率:62.5mW;; LCSC Part Name: 10kΩ ±1% 62.5mW; Supplier Part: C25744; Manufacturer: UNI-ROYAL(厚声); Supplier Footprint: 0402; JLCPCB Part Class: 基础库; Datasheet: https://atta.szlcsc.com/upload/public/pdf/source/20200306/C422600_1E6D84923E4A46A82E41ADD87F860B5C.pdf; Supplier: LCSC; Type: 厚膜电阻; Tolerance: ±1%; Power(Watts): 62.5mW; Temperature Coefficient: ±100ppm/℃; Overload Voltage (Max): 50V; Operating Temperature Range: -55℃~+155℃
R71 = 0402WGF5102TCE: 电阻类型:厚膜电阻;阻值:51kΩ;精度:±1%;功率:62.5mW;; LCSC Part Name: 51kΩ ±1% 62.5mW; Supplier Part: C25794; Manufacturer: UNI-ROYAL(厚声); Supplier Footprint: 0402; JLCPCB Part Class: Basic Part; Datasheet: https://atta.szlcsc.com/upload/public/pdf/source/20200306/C422600_1E6D84923E4A46A82E41ADD87F860B5C.pdf; Supplier: LCSC; Type: 厚膜电阻; Tolerance: ±1%; Power(Watts): 62.5mW; Temperature Coefficient: ±100ppm/℃; Overload Voltage (Max): 50V; Operating Temperature Range: -55℃~+155℃
R72 R77 = ERJ2GEJ2R2X: 电阻类型:厚膜电阻;阻值:2.2Ω;精度:±5%;功率:100mW;温度系数:-100ppm/℃~+600ppm/℃;最大工作电压:-;工作温度范围:-55℃~+155℃;; LCSC Part Name: 2.2Ω ±5% 100mW; Supplier Part: C412897; Manufacturer: PANASONIC(松下); Supplier Footprint: 0402; JLCPCB Part Class: Extended Part; Datasheet: https://atta.szlcsc.com/upload/public/pdf/source/20190820/C412897_57E183A07438428D747B4E51D31956B4.pdf; Supplier: LCSC; Type: 厚膜电阻; Tolerance: ±5%; Power(Watts): 100mW; Temperature Coefficient: -100ppm/℃~+600ppm/℃; Operating Temperature Range: -55℃~+155℃
USB1 = KH-TYPE-C-16P: 连接器类型:Type-C;标准:-;公母:母座;触点数量:16;端口数量:1;安装方式:卧贴;额定电流 - 电源:3A;工作温度范围:-40℃~+85℃;; LCSC Part Name: Type-C 母座 卧贴; Supplier Part: C709357; Manufacturer: kinghelm(金航标); Supplier Footprint: SMD; JLCPCB Part Class: Extended Part; Datasheet: https://atta.szlcsc.com/upload/public/pdf/source/20200911/C709357_AA8DCEB38BB20E3035A7ED7AE7667837.pdf; Supplier: LCSC; Connector Type: Type-C; Gender: 母座; Number of Contacts: 16; Number of Ports: 1; Mounting Style: 卧贴; Current Rating - Power (Max): 3A; Operating Temperature Range: -40℃~+85℃

## Nets
GND: C1.1 C3.1 C4.1 C49.2 C59.1 C60.2 C71.1 C72.1 C89.1 C169.1 C170.1 C248.1 C249.2 C250.1 C251.1 C252.1 C253.1 C879.1 C880.1 C881.1 C882.1 C883.1 C884.1 C885.1 C886.1 C887.1 C888.1 C889.1 C890.1 C891.1 C892.1 C893.1 C894.1 C895.1 C896.1 C897.1 C898.1 C899.1 C900.1 C901.1 C902.1 C903.1 C904.1 C905.1 C906.1 C907.1 C908.1 C921.1 C922.1 C923.1 C927.1 C928.1 C942.1 C950.1 FPC1.1 FPC1.7 FPC1.8 FPC4.1 FPC4.4 FPC4.7 FPC4.10 FPC4.13 FPC4.15 FPC4.17 FPC4.19 FPC4.23 FPC4.25 FPC4.26 R66.2 R67.1 R69.1 R70.1 R71.1 R95.1 R96.1 R97.1 U1.1B10(VSS_30) U1.1B11(VSS_31) U1.1B15(VSS_32) U1.1B19(VSS_33) U1.1C4(VSS_34) U1.1C5(VSS_35) U1.1C6(VSS_36) U1.1C8(VSS_37) U1.1C9(VSS_38) U1.1C14(VSS_39) U1.1C16(VSS_40) U1.1C18(VSS_41) U1.1D1(VSS_42) U1.1D3(VSS_43) U1.1D4(DDR_AVSS) U1.1D10(VSS_44) U1.1D14(VSS_45) U1.1E3(VSS_46) U1.1E8(VSS_47) U1.1E10(VSS_48) U1.1E14(VSS_49) U1.1E15(VSS_50) U1.1E17(VSS_51) U1.1F6(VSS_52) U1.1F7(VSS_53) U1.1F8(VSS_54) U1.1F9(VSS_55) U1.1F10(VSS_56) U1.1F15(VSS_57) U1.1F16(VSS_58) U1.1F20(AVSS1_6) U1.1G3(VSS_59) U1.1G6(VSS_60) U1.1G7(VSS_61) U1.1G8(VSS_62) U1.1G9(VSS_63) U1.1G10(VSS_64) U1.1G11(VSS_65) U1.1G12(VSS_66) U1.1G14(VSS_67) U1.1G16(AVSS1_7) U1.1G17(EDP_TX_AVDD_1V8) U1.1G18(AVSS1_8) U1.1G19(AVSS1_9) U1.1G20(AVSS1_10) U1.1H1(VSS_68) U1.1H2(VSS_69) U1.1H6(VSS_70) U1.1H11(VSS_71) U1.1H12(VSS_72) U1.1H13(VSS_73) U1.1H17(EDP_TX_AVDD_0V9) U1.1J1(VSS_74) U1.1J2(USB_AVDD2_3V3) U1.1J3(USB_AVDD2_1V8) U1.1J4(USB_AVDD2_0V9) U1.1J6(VSS_75) U1.1J8(VSS_76) U1.1J9(VSS_77) U1.1J11(VSS_78) U1.1J12(VSS_79) U1.1J13(VSS_80) U1.1J16(AVSS1_11) U1.1J18(AVSS1_12) U1.1K2(VSS_81) U1.1K3(VSS_82) U1.1K4(VSS_83) U1.1K5(VSS_84) U1.1K6(VSS_85) U1.1K8(VSS_86) U1.1K9(VSS_87) U1.1K11(VSS_88) U1.1K12(VSS_89) U1.1K13(VSS_90) U1.1K14(VSS_91) U1.1K15(VSS_92) U1.1K18(AVSS1_13) U1.1L3(VSS_93) U1.1L6(VSS_94) U1.1L10(VSS_95) U1.1L11(VSS_96) U1.1L12(VSS_97) U1.1L13(VSS_98) U1.1L14(VSS_99) U1.1L15(VSS_100) U1.1L19(AVSS1_14) U1.1M3(VSS_101) U1.1M4(VSS_102) U1.1M5(VSS_103) U1.1M6(VSS_104) U1.1M10(VSS_105) U1.1M11(VSS_106) U1.1M12(VSS_107) U1.1M13(VSS_108) U1.1M14(VSS_109) U1.1M15(VSS_110) U1.1M16(VSS_111) U1.1M17(VSS_112) U1.1M20(VSS_113) U1.1N3(VSS_114) U1.1N4(VSS_115) U1.1N7(VSS_116) U1.1N11(AVSS_9) U1.1N12(AVSS_10) U1.1N13(HDMI_TX_AVDD_02V9_2) U1.1N14(HDMI_TX_AVDD_02V9_1) U1.1P1(VSS_117) U1.1P5(VSS_118) U1.1P6(VSS_119) U1.1P7(VSS_120) U1.1P8(AVSS_11) U1.1P10(AVSS_12) U1.1P11(MIPI_DSI_TX0/LVDS_TX0_AVDD_0V9) U1.1P12(MIPI_DSI_TX0/LVDS_TX0_AVDD_1V8) U1.1P13(HDMI_TX_AVDD_1V8) U1.1P14(AVSS_13) U1.1P15(VSS_121) U1.1R3(VSS_122) U1.1R4(VSS_123) U1.1R5(VSS_124) U1.1R6(VSS_125) U1.1R7(VSS_126) U1.1R8(AVSS_14) U1.1R9(AVSS_15) U1.1R11(AVSS_16) U1.1R12(AVSS_17) U1.1R13(AVSS_18) U1.1R14(AVSS_19) U1.1R15(AVSS_20) U1.1T3(VSS_127) U1.1T5(VSS_128) U1.1T7(AVSS_21) U1.1T8(AVSS_22) U1.1T9(AVSS_23) U1.1T10(AVSS_24) U1.1T11(AVSS_25) U1.1T12(AVSS_26) U1.1T13(AVSS_27) U1.1T14(AVSS_28) U1.1T15(AVSS_29) U1.1T16(AVSS_30) U1.1T17(AVSS_31) U1.1U2(VSS_129) U1.1U12(AVSS_32) U1.1U13(AVSS_33) U1.1U15(AVSS_34) U1.1U17(AVSS_35) U1.1V1(VSS_130) U1.1V4(VSS_131) U1.1V7(AVSS_36) U1.1V12(AVSS_37) U1.1V13(AVSS_38) U1.1V18(AVSS_39) U1.A1(VSS_1) U1.A2(VSS_2) U1.A38(VSS_3) U1.AA2(VSS_18) U1.AC37(VSS_24) U1.AD2(VSS_19) U1.AE37(VSS_25) U1.AH37(VSS_26) U1.AL37(VSS_27) U1.AP2(VSS_20) U1.AP8(VSS_22) U1.AP13(AVSS_1) U1.AP16(AVSS_2) U1.AP19(AVSS_3) U1.AP22(AVSS_4) U1.AP25(AVSS_5) U1.AP28(AVSS_6) U1.AP31(AVSS_7) U1.AP34(AVSS_8) U1.AP37(VSS_28) U1.AR1(VSS_21) U1.AR38(VSS_29) U1.B1(VSS_4) U1.B2(VSS_5) U1.B6(VSS_6) U1.B11(VSS_7) U1.B14(VSS_8) U1.B18(VSS_9) U1.B21(VSS_10) U1.B28(VSS_11) U1.B31(VSS_12) U1.D2(VSS_13) U1.E37(VSS_23) U1.H37(AVSS1_1) U1.J2(VSS_14) U1.L2(VSS_15) U1.L37(AVSS1_2) U1.P37(AVSS1_3) U1.U2(VSS_16) U1.U37(AVSS1_4) U1.W2(VSS_17) U1.Y37(AVSS1_5) U140.2(GND) USB1.1(EP) USB1.2(EP) USB1.3(EP) USB1.4(EP) USB1.A1(GND) USB1.A12(GND) USB1.B1(GND) USB1.B12(GND) ; also on sheet 9 10 11 12 13 14 15 16 17 18 19 20 21 22 23 24 25
VCC5V0_SYS: C169.2 C170.2 C249.1 F2.2 L20.1 U140.6(IN) ; also on sheet 10 19 20 21 22
VCC5V0_USB_OTG: Q10.3(D) Q11.2(E) R68.2 USB1.A4(VBUS) USB1.A9(VBUS) USB1.B4(VBUS) USB1.B9(VBUS)
VCC_3V3: C250.2 C251.2 C252.2 C253.2 C921.2 FPC1.6 FPC4.11 FPC4.12 FPC4.14 U1.1H18(USB_AVDD1_3V3) ; also on sheet 13 15 16 17 21 22 25
VCCA1V8_IMAGE: C71.2 U1.1R10(MIPI_DSI_TX1_AVDD_1V8) ; also on sheet 11 22
VCCA_1V8: C922.2 C927.2 U1.1H16(USB_AVDD1_1V9) U1.1K17(MULTI_PHY_AVDD_1V8) ; also on sheet 13 14 19 22
VCCIO_ACODEC: C89.2 U1.1D13(VCCIO1) ; also on sheet 20 22
VCCIO_FLASH: C49.1 U1.1C13(VCCIO2) ; also on sheet 21 25
VCCIO_SD: C942.2 U1.1F17(VCCIO3) ; also on sheet 22
VDD2_DDR: C899.2 C905.2 C906.2 C907.2 C908.2 R662.2 U1.1D5(DDR_VDDQ_1) U1.1D6(DDR_VDDQ_2) U1.1D7(DDR_VDDQ_3) U1.1D8(DDR_VDDQ_4) U1.1D9(DDR_VDDQ_5) U1.1E4(DDR_VDDQ_6) U1.1F4(DDR_VDDQ_7) U1.1G4(DDR_VDDQ_8) ; also on sheet 22 24
VDD_CPU: C1.2 C3.2 C4.2 C879.2 C887.2 C888.2 C892.2 U1.1C12(VDD_CPU_1) U1.1D11(VDD_CPU_2) U1.1D12(VDD_CPU_3) U1.1E11(VDD_CPU_4) U1.1E12(VDD_CPU_5) U1.1E13(VDD_CPU_6) U1.1F11(VDD_CPU_7) U1.1F12(VDD_CPU_8) U1.1F13(VDD_CPU_9) U1.1F14(VDD_CPU_10) U1.1G13(VDD_CPU_11) ; also on sheet 21
VDD_GPU: C883.2 C885.2 C890.2 C895.2 C896.2 U1.1L8(VDD_GPU_1) U1.1L9(VDD_GPU_2) U1.1M7(VDD_GPU_3) U1.1M8(VDD_GPU_4) U1.1M9(VDD_GPU_5) ; also on sheet 22
VDD_LOGIC: C880.2 C881.2 C882.2 C886.2 C891.2 C893.2 C894.2 U1.1H7(VDD_LOGIC_1) U1.1H8(VDD_LOGIC_2) U1.1H9(VDD_LOGIC_3) U1.1H10(VDD_LOGIC_4) U1.1J7(VDD_LOGIC_5) U1.1J10(VDD_LOGIC_6) U1.1K7(VDD_LOGIC_7) U1.1K10(VDD_LOGIC_8) U1.1L7(VDD_LOGIC_9) ; also on sheet 22
VDD_NPU: C884.2 C889.2 C897.2 C898.2 U1.1G15(VDD_NPU_1) U1.1H14(VDD_NPU_2) U1.1H15(VDD_NPU_3) U1.1J14(VDD_NPU_4) U1.1J15(VDD_NPU_5) ; also on sheet 22
VDDA0V9_IMAGE: C72.2 U1.1N10(MIPI_DSI_TX1_AVDD_0V9) ; also on sheet 11 22
VDDA_0V9: C59.2 C60.1 C923.2 C950.2 U1.1J17(USB_AVDD1_0V9) U1.1K16(MULTI_PHY_AVDD_0V9) ; also on sheet 14 22
VDDQ_DRAM: C900.2 C901.2 C902.2 C903.2 C904.2 U1.1E6(DDR_VDDQL_1) U1.1E7(DDR_VDDQL_2) U1.1E9(DDR_VDDQL_3) U1.1F5(DDR_VDDQL_4) U1.1G5(DDR_VDDQL_5) ; also on sheet 24
DMU: U1.1J20(USB_HOST1_DM) ; also on sheet 12
DPU: U1.1J19(USB_HOST1_DP) ; also on sheet 12
EMMC_CLKOUT: R641.2 ; also on sheet 25
EMMC_CMD: U1.A27(GPIO1_C4_u) ; also on sheet 25
EMMC_D0: U1.A32(GPIO1_B4_u) ; also on sheet 19 25
EMMC_D1: U1.B27(GPIO1_B5_u) ; also on sheet 25
EMMC_D2: U1.B32(GPIO1_B6_u) ; also on sheet 25
EMMC_D3: U1.B29(GPIO1_B7_u) ; also on sheet 25
EMMC_D4: U1.B33(GPIO1_C0_u) ; also on sheet 25
EMMC_D5: U1.A30(GPIO1_C1_u) ; also on sheet 25
EMMC_D6: U1.B30(GPIO1_C2_u) ; also on sheet 25
EMMC_D7: U1.A33(GPIO1_C3_u) ; also on sheet 25
EMMC_DATA_STROBE: R640.2 ; also on sheet 25
EMMC_DATA_STROBE/FLASH_CLE: R640.1 U1.1A16(GPIO1_C6_d)
EMMC_RSTN: U1.1B16(GPIO1_C7_d) ; also on sheet 25
GPIO0_C5: R97.2 U140.4(EN/PWM) ; also on sheet 14
I2C1_SCL_TP: FPC1.4 ; also on sheet 9 14 17
I2C1_SDA_TP: FPC1.3 ; also on sheet 9 14 17
I2S1_LRCK_TX_M0_PMIC: U1.B24(GPIO1_A5_d) ; also on sheet 22
I2S1_MCLK_M0_PMIC: U1.A23(GPIO1_A2_d) ; also on sheet 22
I2S1_SCLK_TX_M0_PMIC: U1.B23(GPIO1_A3_d) ; also on sheet 22
I2S1_SDI0_M0/PDM: U1.1B14(GPIO1_B3_d) ; also on sheet 22
I2S1_SDO0_M0_PMIC: U1.B25(GPIO1_A7_d) ; also on sheet 22
LPDDR4_A0_A: U1.C2(LPDDR4_A0_A) ; also on sheet 24
LPDDR4_A0_B: U1.A9(LPDDR4_A0_B) ; also on sheet 24
LPDDR4_A1_A: U1.C1(LPDDR4_A1_A) ; also on sheet 24
LPDDR4_A1_B: U1.B9(LPDDR4_A1_B) ; also on sheet 24
LPDDR4_A2_A: U1.1C1(LPDDR4_A2_A) ; also on sheet 24
LPDDR4_A2_B: U1.1B7(LPDDR4_A2_B) ; also on sheet 24
LPDDR4_A3_A: U1.1B3(LPDDR4_A3_A) ; also on sheet 24
LPDDR4_A3_B: U1.1B6(LPDDR4_A3_B) ; also on sheet 24
LPDDR4_A4_A: U1.1B1(LPDDR4_A4_A) ; also on sheet 24
LPDDR4_A4_B: U1.1A6(LPDDR4_A4_B) ; also on sheet 24
LPDDR4_A5_A: U1.1A1(LPDDR4_A5_A) ; also on sheet 24
LPDDR4_A5_B: U1.B8(LPDDR4_A5_B) ; also on sheet 24
LPDDR4_CKE0_A: U1.B4(LPDDR4_CKE0_A) ; also on sheet 24
LPDDR4_CKE0_B: U1.1A3(LPDDR4_CKE0_B) ; also on sheet 24
LPDDR4_CKE1_A: U1.1C3(LPDDR4_CKE1_A) ; also on sheet 24
LPDDR4_CKE1_B: U1.1A2(LPDDR4_CKE1_B) ; also on sheet 24
LPDDR4_CLKN_A: U1.B5(LPDDR4_CLKN_A) ; also on sheet 24
LPDDR4_CLKN_B: U1.B7(LPDDR4_CLKN_B) ; also on sheet 24
LPDDR4_CLKP_A: U1.A5(LPDDR4_CLKP_A) ; also on sheet 24
LPDDR4_CLKP_B: U1.A7(LPDDR4_CLKP_B) ; also on sheet 24
LPDDR4_CSN0_A: U1.B3(LPDDR4_CS0n_A) ; also on sheet 24
LPDDR4_CSN0_B: U1.1B5(LPDDR4_CS0n_B) ; also on sheet 24
LPDDR4_CSN1_A: U1.A3(LPDDR4_CS1n_A) ; also on sheet 24
LPDDR4_CSN1_B: U1.1A5(LPDDR4_CS1n_B) ; also on sheet 24
LPDDR4_DMI0_A: U1.1E2(LPDDR4_DM0_A) ; also on sheet 24
LPDDR4_DMI0_B: U1.1B8(LPDDR4_DM0_B) ; also on sheet 24
LPDDR4_DMI1_A: U1.1G1(LPDDR4_DM1_A) ; also on sheet 24
LPDDR4_DMI1_B: U1.1A11(LPDDR4_DM1_B) ; also on sheet 24
LPDDR4_DQ0_A: U1.G2(LPDDR4_DQ0_A) ; also on sheet 24
LPDDR4_DQ0_B: U1.B12(LPDDR4_DQ0_B) ; also on sheet 24
LPDDR4_DQ1_A: U1.F2(LPDDR4_DQ1_A) ; also on sheet 24
LPDDR4_DQ1_B: U1.B10(LPDDR4_DQ1_B) ; also on sheet 24
LPDDR4_DQ2_A: U1.F1(LPDDR4_DQ2_A) ; also on sheet 24
LPDDR4_DQ2_B: U1.1A8(LPDDR4_DQ2_B) ; also on sheet 24
LPDDR4_DQ3_A: U1.E1(LPDDR4_DQ3_A) ; also on sheet 24
LPDDR4_DQ3_B: U1.1A7(LPDDR4_DQ3_B) ; also on sheet 24
LPDDR4_DQ4_A: U1.M2(LPDDR4_DQ4_A) ; also on sheet 24
LPDDR4_DQ4_B: U1.B13(LPDDR4_DQ4_B) ; also on sheet 24
LPDDR4_DQ5_A: U1.K1(LPDDR4_DQ5_A) ; also on sheet 24
LPDDR4_DQ5_B: U1.1A10(LPDDR4_DQ5_B) ; also on sheet 24
LPDDR4_DQ6_A: U1.K2(LPDDR4_DQ6_A) ; also on sheet 24
LPDDR4_DQ6_B: U1.1B9(LPDDR4_DQ6_B) ; also on sheet 24
LPDDR4_DQ7_A: U1.1E1(LPDDR4_DQ7_A) ; also on sheet 24
LPDDR4_DQ7_B: U1.1A9(LPDDR4_DQ7_B) ; also on sheet 24
LPDDR4_DQ8_A: U1.P2(LPDDR4_DQ8_A) ; also on sheet 24
LPDDR4_DQ8_B: U1.B19(LPDDR4_DQ8_B) ; also on sheet 24
LPDDR4_DQ9_A: U1.R1(LPDDR4_DQ9_A) ; also on sheet 24
LPDDR4_DQ9_B: U1.A19(LPDDR4_DQ9_B) ; also on sheet 24
LPDDR4_DQ10_A: U1.R2(LPDDR4_DQ10_A) ; also on sheet 24
LPDDR4_DQ10_B: U1.A20(LPDDR4_DQ10_B) ; also on sheet 24
LPDDR4_DQ11_A: U1.T2(LPDDR4_DQ11_A) ; also on sheet 24
LPDDR4_DQ11_B: U1.B20(LPDDR4_DQ11_B) ; also on sheet 24
LPDDR4_DQ12_A: U1.M1(LPDDR4_DQ12_A) ; also on sheet 24
LPDDR4_DQ12_B: U1.A15(LPDDR4_DQ12_B) ; also on sheet 24
LPDDR4_DQ13_A: U1.1F2(LPDDR4_DQ13_A) ; also on sheet 24
LPDDR4_DQ13_B: U1.B15(LPDDR4_DQ13_B) ; also on sheet 24
LPDDR4_DQ14_A: U1.1F1(LPDDR4_DQ14_A) ; also on sheet 24
LPDDR4_DQ14_B: U1.1C10(LPDDR4_DQ14_B) ; also on sheet 24
LPDDR4_DQ15_A: U1.1G2(LPDDR4_DQ15_A) ; also on sheet 24
LPDDR4_DQ15_B: U1.B16(LPDDR4_DQ15_B) ; also on sheet 24
LPDDR4_DQS0N_A: U1.H1(LPDDR4_DQS0N_A) ; also on sheet 24
LPDDR4_DQS0N_B: U1.A12(LPDDR4_DQS0N_B) ; also on sheet 24
LPDDR4_DQS0P_A: U1.H2(LPDDR4_DQS0P_A) ; also on sheet 24
LPDDR4_DQS0P_B: U1.A13(LPDDR4_DQS0P_B) ; also on sheet 24
LPDDR4_DQS1N_A: U1.N2(LPDDR4_DQS1N_A) ; also on sheet 24
LPDDR4_DQS1N_B: U1.B17(LPDDR4_DQS1N_B) ; also on sheet 24
LPDDR4_DQS1P_A: U1.N1(LPDDR4_DQS1P_A) ; also on sheet 24
LPDDR4_DQS1P_B: U1.A17(LPDDR4_DQS1P_B) ; also on sheet 24
LPDDR4_ODT0_CA_A: U1.E2(LPDDR4_ODT0_CA_A) ; also on sheet 24
LPDDR4_ODT0_CA_B: U1.A10(LPDDR4_ODT0_CA_B) ; also on sheet 24
LPDDR4_RESET: U1.1C7(LPDDR4_RESETn) ; also on sheet 24
MIPI_DSI_0N: FPC4.2 U1.AR24(MIPI_DSI_TX1_D0n)
MIPI_DSI_0P: FPC4.3 U1.AP24(MIPI_DSI_TX1_D0p)
MIPI_DSI_1N: FPC4.8 U1.AP23(MIPI_DSI_TX1_D1n)
MIPI_DSI_1P: FPC4.9 U1.AR23(MIPI_DSI_TX1_D1p)
MIPI_DSI_2N: U1.AR21(MIPI_DSI_TX1_D2n)
MIPI_DSI_2P: U1.AP21(MIPI_DSI_TX1_D2p)
MIPI_DSI_3N: U1.AP20(MIPI_DSI_TX1_D3n)
MIPI_DSI_3P: U1.AR20(MIPI_DSI_TX1_D3p)
MIPI_DSI_CLKN: FPC4.5 U1.1U11(MIPI_DSI_TX1_CLKn)
MIPI_DSI_CLKP: FPC4.6 U1.1V11(MIPI_DSI_TX1_CLKp)
MIPI_DSI_RESET: FPC4.18 ; also on sheet 15
MIPI_DSI_VCC_LED+: C248.2 D7.1(C) FPC4.24 U140.5(OVP)
MIPI_DSI_VCC_LED-: FPC4.22 R95.2 R96.2 U140.3(FB)
PDM_CLK0_M0_PMIC: U1.1A14(GPIO1_A6_d) ; also on sheet 22
SDMMC0_CLK: R14.2 ; also on sheet 18
SDMMC0_CMD: U1.1E19(GPIO2_A1_u) ; also on sheet 18
SDMMC0_D0: U1.1E20(GPIO1_D5_u) ; also on sheet 18
SDMMC0_D1: U1.1F19(GPIO1_D6_u) ; also on sheet 18
SDMMC0_D2: U1.1D20(GPIO1_D7_u) ; also on sheet 18
SDMMC0_D3: U1.1F18(GPIO2_A0_u) ; also on sheet 18
TP_INT: FPC1.5 U1.A22(GPIO1_A0_u)
TP_RST: FPC1.2 U1.B22(GPIO1_A1_u)
USB2_HOST2_DM: U1.V1(USB_HOST2_DM)
USB2_HOST2_DP: U1.V2(USB_HOST2_DP)
USB_OTG0_DM: R77.2 U1.R38(USB_OTG0_DM)
USB_OTG0_DP: R72.2 U1.R37(USB_OTG0_DP)
USB_OTG0_VBUSDET: C928.2 R68.1 R69.2 U1.T38(USB_OTG0_VBUSDET)
USB_OTG_DM: R77.1 USB1.A7(DN1) USB1.B7(DN2)
USB_OTG_DP: R72.1 USB1.A6(DP1) USB1.B6(DP2)
$2N1039: R662.1 U1.1F3(DDR_RZQ)
$4N2113: R641.1 U1.A29(GPIO1_C5_d)
$4N4845: R14.1 U1.G38(GPIO2_A2_d)
$12N7016: D7.2(A) L20.2 U140.1(LX)
$22N1612: R66.1 USB1.A5(CC1)
$22N1614: R67.2 USB1.B5(CC2)
$22N1640: F2.1 Q10.2(S) Q12.2(E)
$22N1643: Q10.1(G) Q12.3(C) R71.2
$22N1644: Q11.1(B) Q11.3(C) Q12.1(B) R70.2

Not connected (* = marked no-connect by the designer): FPC4 16* 20* 21*; U1 1A4(LPDDR4_ODT1_CA_B)* 1A13(GPIO1_A4_d)* 1A15(GPIO1_D0_d)* 1A17(GPIO1_D1_u)* 1A18(GPIO1_D2_u)* 1B13(GPIO1_B0_d)* 1B17(GPIO1_D3_u)* 1C2(LPDDR4_ODT1_CA_A)* 1C15(GPIO1_D4_u)* 1D2* 1H3(ODR_VREFOUT)* 1H19(EDP_TX_AUXp)* 1H20(EDP_TX_AUXn)* 1K19(PCIE20_REFCLKp)* 1K20(PCIE20_REFCLKn)* 1U16(HDMI_TX_REXT)* 1V15(MIPI_DSI_TX0_CLKn/LVDS_TX0_CLKn)* 1V16(MIPI_DSI_TX0_CLKp/LVDS_TX0_CLKp)* 1V17(HDMI_TX_HPDIN)* A26(GPIO1_B1_d)* AA37(PCIE20_TXp/SATA2_TXp)* AA38(PCIE20_TXn/SATA2_TXn)* AB37(PCIE20_RXp/SATA2_RXp)* AB38(PCIE20_RXn/SATA2_RXn)* AP26(MIPI_DSI_TX0_D0p/LVDS_TX0_D3n)* AP27(MIPI_DSI_TX0_D0p/LVDS_TX0_D2p)* AP29(MIPI_DSI_TX0_D0p/LVDS_TX0_D1n)* AP30(MIPI_DSI_TX0_D0p/LVDS_TX0_D0p)* AP32(HDMI_TX_CLKn)* AP33(HDMI_TX_D0p)* AP35(HDMI_TX_D1n)* AP36(HDMI_TX_D2p)* AR26(MIPI_DSI_TX0_D0p/LVDS_TX0_D3p)* AR27(MIPI_DSI_TX0_D0p/LVDS_TX0_D2n)* AR29(MIPI_DSI_TX0_D0p/LVDS_TX0_D1p)* AR30(MIPI_DSI_TX0_D0p/LVDS_TX0_D0n)* AR32(HDMI_TX_CLKp)* AR33(HDMI_TX_D0n)* AR35(HDMI_TX_D1p)* AR36(HDMI_TX_D2n)* B26(GPIO1_B2_d)* J37(EDP_TX_D0p)* J38(EDP_TX_D0n)* K37(EDP_TX_D1n)* K38(EDP_TX_D1p)* M37(EDP_TX_D2p)* M38(EDP_TX_D2n)* N37(EDP_TX_D3p)* N38(EDP_TX_D3n)* T37(USB_OTG0_ID)* V37(USB3_HOST1_SSRXn/SATA1_RXx)* V38(USB3_HOST1_SSRXp/SATA1_RXp)* W37(USB3_HOST1_SSTXp/SATA1_TXp)* W38(USB3_HOST1_SSTXn/SATA1_TXn)* Y1(USB_HOST3_DM)* Y2(USB_HOST3_DP)*; USB1 A8(SUB1)* B8(SUB2)*

## Notes on the sheets
sheet 3
- eMMC  Short 'eMMC_D0' and
  GND to enter Maskrom Mode.
- Be sure to reserve the testpoints for
  firmware burning or update.
- 软件dts的电压配置严格与硬件设计保持一致！
- Check the software configuration(dts)
  of voltage level, which must be
  keep the same as hardware design.
- VCCIO2/3
sheet 4
- (MIPI_DSI_TX1)
- (MIPI_DSI_TX0/LVDS_TX0)
- (eDP TX)
- (HDMI2.0 TX)
sheet 5
- 软件dts的电压配置严格与硬件设计保持一致！
- Check the software configuration(dts)
  of voltage level, which must be
  keep the same as hardware design.
- VCCIO1
sheet 6
- 5V POWER IN
- OTG_VBUSDET
- Power selection
sheet 7
- LCM_MIPI_DSI_Panel
- Adjust power supply according to specific panel needs.
- TP
sheet 8
- Caps should be placed
  under the U20 package
- USB2.0 HOST
- USB3.0/PCIe2.0x1/SATA
